# Altium project NEXUS32.PrjPcb (part 1 of 2)
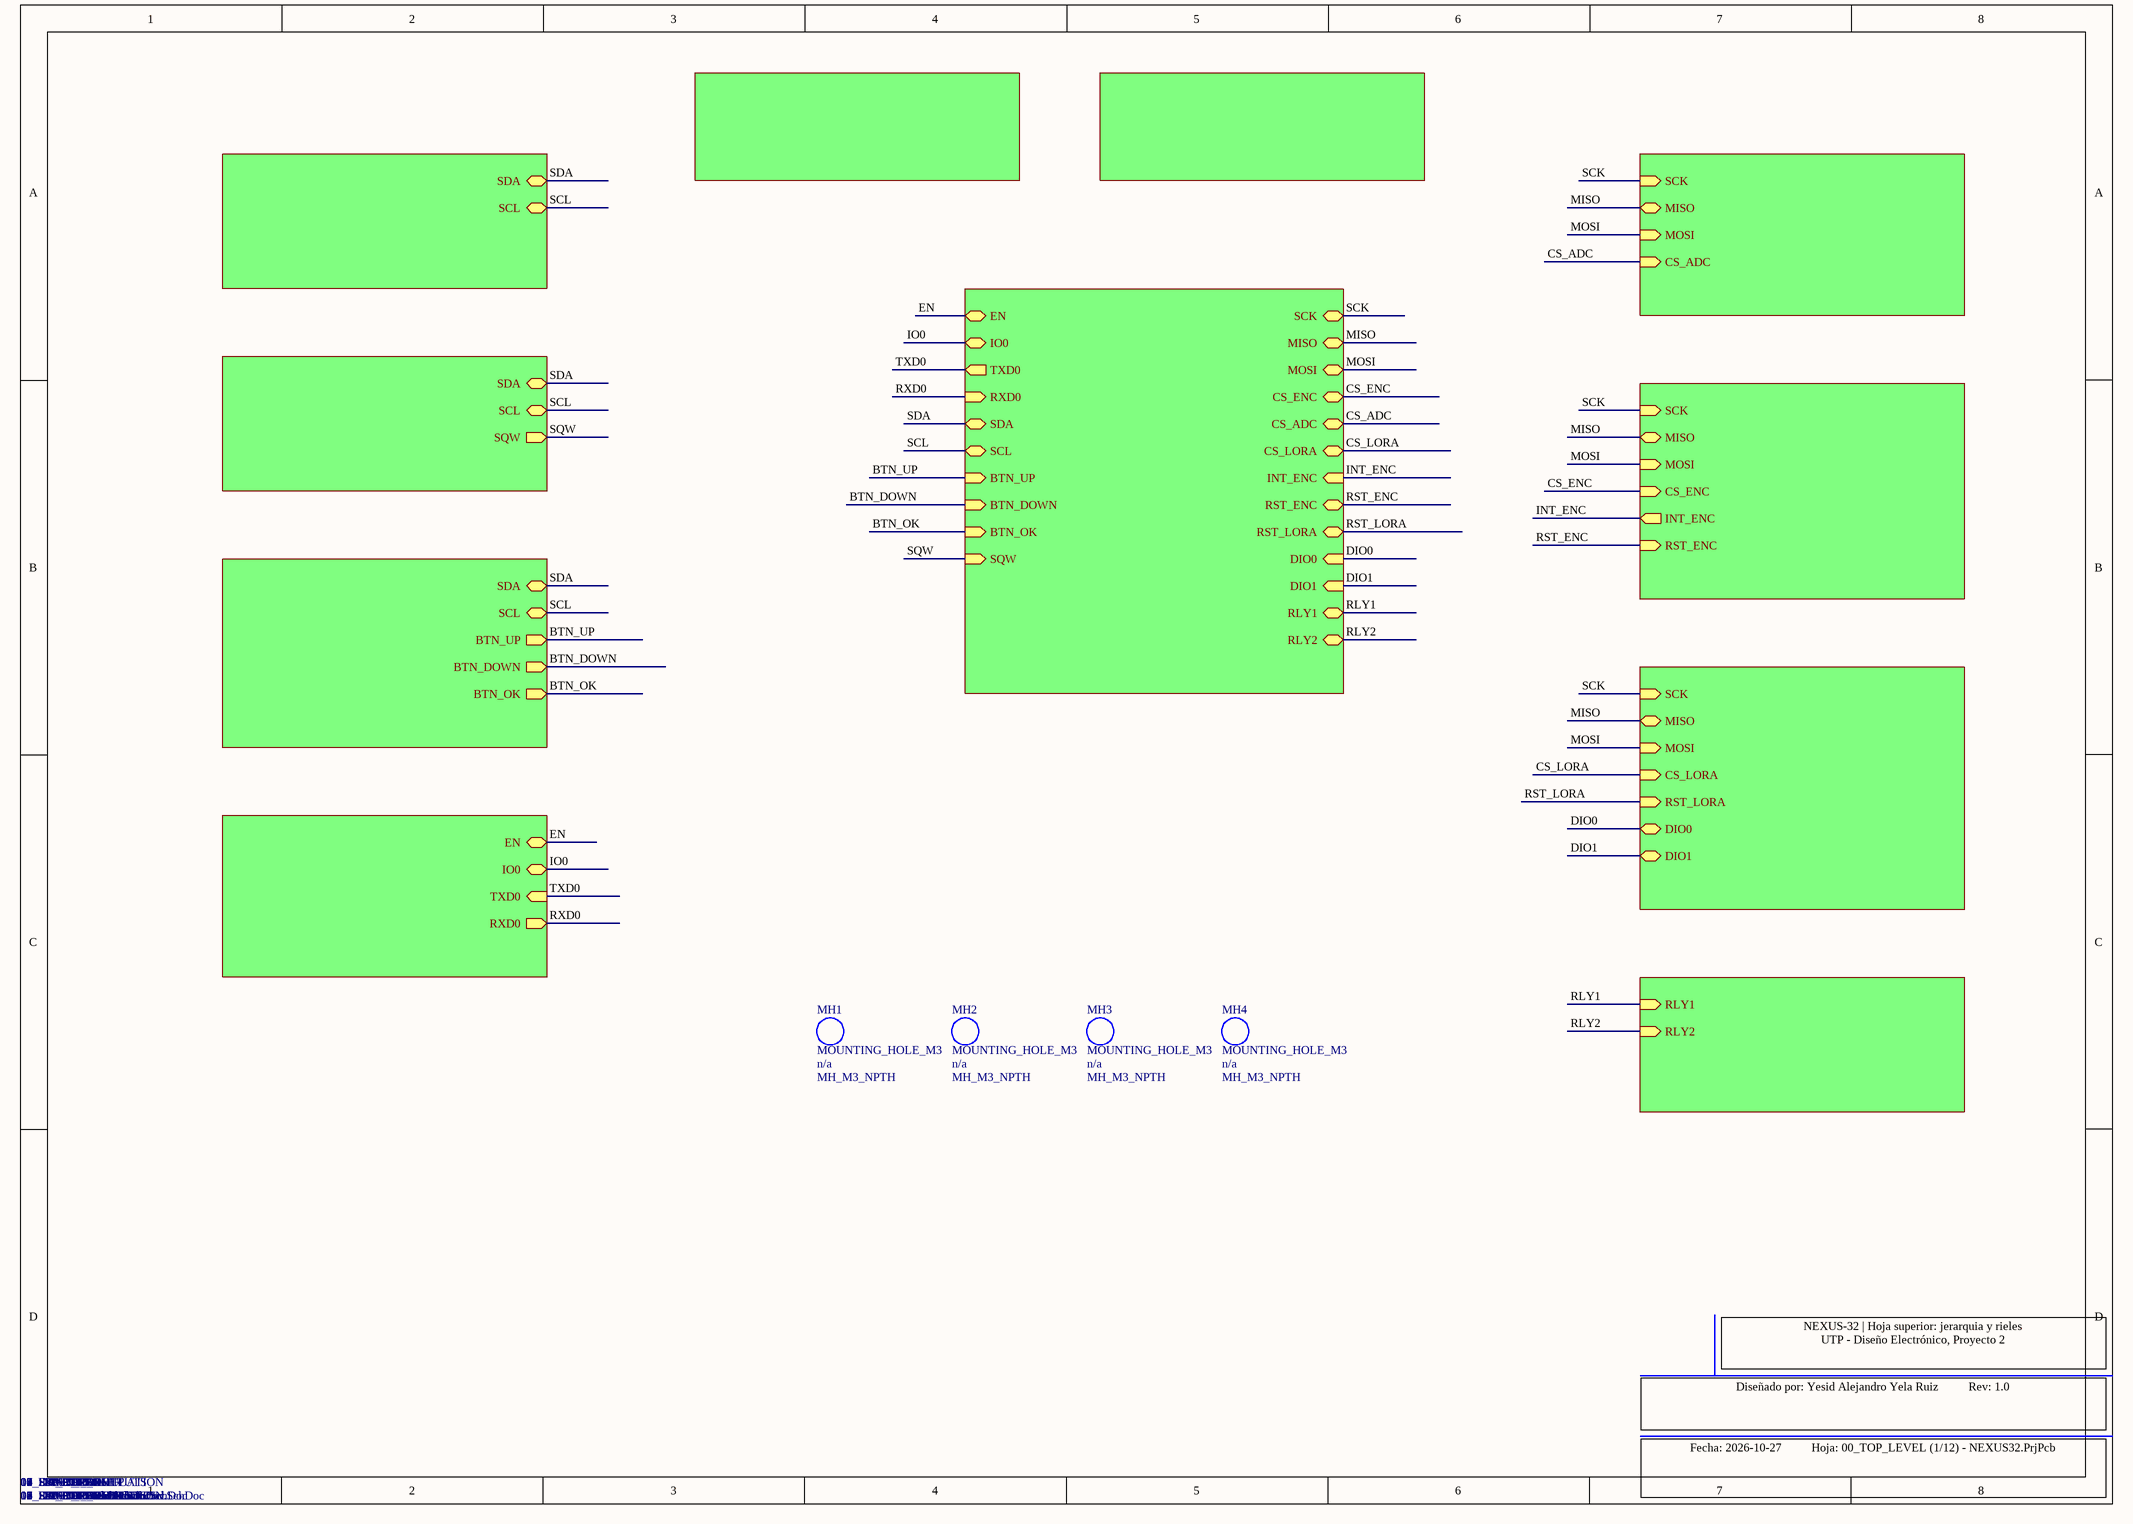
[diagram p0: 00_TOP_LEVEL.SchDoc]
12 sheets, 220 parts. Net scope: hierarchical (ports join the sheet entries above them; power ports are global).
Board file: NEXUS32.PcbDoc
Sheets:
  00_TOP_LEVEL.SchDoc
    03_ESP32_CORE = 03_ESP32_CORE.SchDoc
    04_I2C_EEPROM = 04_I2C_EEPROM.SchDoc
    05_I2C_RTC = 05_I2C_RTC.SchDoc
    06_I2C_OLED = 06_I2C_OLED.SchDoc
    10_UART_USB = 10_UART_USB.SchDoc
    07_SPI_ADC = 07_SPI_ADC.SchDoc
    08_SPI_ETHERNET = 08_SPI_ETHERNET.SchDoc
    09_SPI_LORA = 09_SPI_LORA.SchDoc
    11_DIGITAL_OUTPUTS = 11_DIGITAL_OUTPUTS.SchDoc
    01_INPUT_POWER = 01_INPUT_POWER.SchDoc
    02_POWER_REGULATION = 02_POWER_REGULATION.SchDoc

## Sheet 00_TOP_LEVEL.SchDoc
size A3

### Parts
MH1  MOUNTING_HOLE_M3  Manufacturer Part Number: MH_M3_NPTH  [MH_M3]
MH2  MOUNTING_HOLE_M3  Manufacturer Part Number: MH_M3_NPTH  [MH_M3]
MH3  MOUNTING_HOLE_M3  Manufacturer Part Number: MH_M3_NPTH  [MH_M3]
MH4  MOUNTING_HOLE_M3  Manufacturer Part Number: MH_M3_NPTH  [MH_M3]

### Sub-sheets
01_INPUT_POWER = 01_INPUT_POWER.SchDoc: no entries
02_POWER_REGULATION = 02_POWER_REGULATION.SchDoc: no entries
03_ESP32_CORE = 03_ESP32_CORE.SchDoc: EN (bidir), IO0 (bidir), TXD0 (out), RXD0 (in), SDA (bidir), SCL (bidir), BTN_UP (in), BTN_DOWN (in), BTN_OK (in), SQW (in), SCK (bidir), MISO (bidir), MOSI (bidir), CS_ENC (bidir), CS_ADC (bidir), CS_LORA (bidir), INT_ENC (in), RST_ENC (bidir), RST_LORA (bidir), DIO0 (in), DIO1 (in), RLY1 (bidir), RLY2 (bidir)
04_I2C_EEPROM = 04_I2C_EEPROM.SchDoc: SDA (bidir), SCL (bidir)
05_I2C_RTC = 05_I2C_RTC.SchDoc: SDA (bidir), SCL (bidir), SQW (out)
06_I2C_OLED = 06_I2C_OLED.SchDoc: SDA (bidir), SCL (bidir), BTN_UP (out), BTN_DOWN (out), BTN_OK (out)
07_SPI_ADC = 07_SPI_ADC.SchDoc: SCK (in), MISO (bidir), MOSI (in), CS_ADC (in)
08_SPI_ETHERNET = 08_SPI_ETHERNET.SchDoc: SCK (in), MISO (bidir), MOSI (in), CS_ENC (in), INT_ENC (out), RST_ENC (in)
09_SPI_LORA = 09_SPI_LORA.SchDoc: SCK (in), MISO (bidir), MOSI (in), CS_LORA (in), RST_LORA (in), DIO0 (bidir), DIO1 (bidir)
10_UART_USB = 10_UART_USB.SchDoc: EN (bidir), IO0 (bidir), TXD0 (in), RXD0 (out)
11_DIGITAL_OUTPUTS = 11_DIGITAL_OUTPUTS.SchDoc: RLY1 (in), RLY2 (in)

### Nets
BTN_DOWN: sheet 03_ESP32_CORE/BTN_DOWN, sheet 06_I2C_OLED/BTN_DOWN
BTN_OK: sheet 03_ESP32_CORE/BTN_OK, sheet 06_I2C_OLED/BTN_OK
BTN_UP: sheet 03_ESP32_CORE/BTN_UP, sheet 06_I2C_OLED/BTN_UP
CS_ADC: sheet 03_ESP32_CORE/CS_ADC, sheet 07_SPI_ADC/CS_ADC
CS_ENC: sheet 03_ESP32_CORE/CS_ENC, sheet 08_SPI_ETHERNET/CS_ENC
CS_LORA: sheet 03_ESP32_CORE/CS_LORA, sheet 09_SPI_LORA/CS_LORA
DIO0: sheet 03_ESP32_CORE/DIO0, sheet 09_SPI_LORA/DIO0
DIO1: sheet 03_ESP32_CORE/DIO1, sheet 09_SPI_LORA/DIO1
EN: sheet 03_ESP32_CORE/EN, sheet 10_UART_USB/EN
INT_ENC: sheet 03_ESP32_CORE/INT_ENC, sheet 08_SPI_ETHERNET/INT_ENC
IO0: sheet 03_ESP32_CORE/IO0, sheet 10_UART_USB/IO0
MISO: sheet 03_ESP32_CORE/MISO, sheet 07_SPI_ADC/MISO, sheet 08_SPI_ETHERNET/MISO, sheet 09_SPI_LORA/MISO
MOSI: sheet 03_ESP32_CORE/MOSI, sheet 07_SPI_ADC/MOSI, sheet 08_SPI_ETHERNET/MOSI, sheet 09_SPI_LORA/MOSI
RLY1: sheet 03_ESP32_CORE/RLY1, sheet 11_DIGITAL_OUTPUTS/RLY1
RLY2: sheet 03_ESP32_CORE/RLY2, sheet 11_DIGITAL_OUTPUTS/RLY2
RST_ENC: sheet 03_ESP32_CORE/RST_ENC, sheet 08_SPI_ETHERNET/RST_ENC
RST_LORA: sheet 03_ESP32_CORE/RST_LORA, sheet 09_SPI_LORA/RST_LORA
RXD0: sheet 03_ESP32_CORE/RXD0, sheet 10_UART_USB/RXD0
SCK: sheet 03_ESP32_CORE/SCK, sheet 07_SPI_ADC/SCK, sheet 08_SPI_ETHERNET/SCK, sheet 09_SPI_LORA/SCK
SCL: sheet 03_ESP32_CORE/SCL, sheet 04_I2C_EEPROM/SCL, sheet 05_I2C_RTC/SCL, sheet 06_I2C_OLED/SCL
SDA: sheet 03_ESP32_CORE/SDA, sheet 04_I2C_EEPROM/SDA, sheet 05_I2C_RTC/SDA, sheet 06_I2C_OLED/SDA
SQW: sheet 03_ESP32_CORE/SQW, sheet 05_I2C_RTC/SQW
TXD0: sheet 03_ESP32_CORE/TXD0, sheet 10_UART_USB/TXD0

### Notes on the sheet
- NEXUS-32 | Hoja superior: jerarquia y rieles
  UTP - Diseño Electrónico, Proyecto 2
- Diseñado por: Yesid Alejandro Yela Ruiz          Rev: 1.0
- Fecha: 2026-10-27          Hoja: 00_TOP_LEVEL (1/12) - NEXUS32.PrjPcb

### Library data of the parts
MH1-MH4 = MOUNTING_HOLE_M3: Agujero de montaje M3 NPTH (sin pines, sin red); Manufacturer: n/a

## Sheet 03_ESP32_CORE.SchDoc
size A3
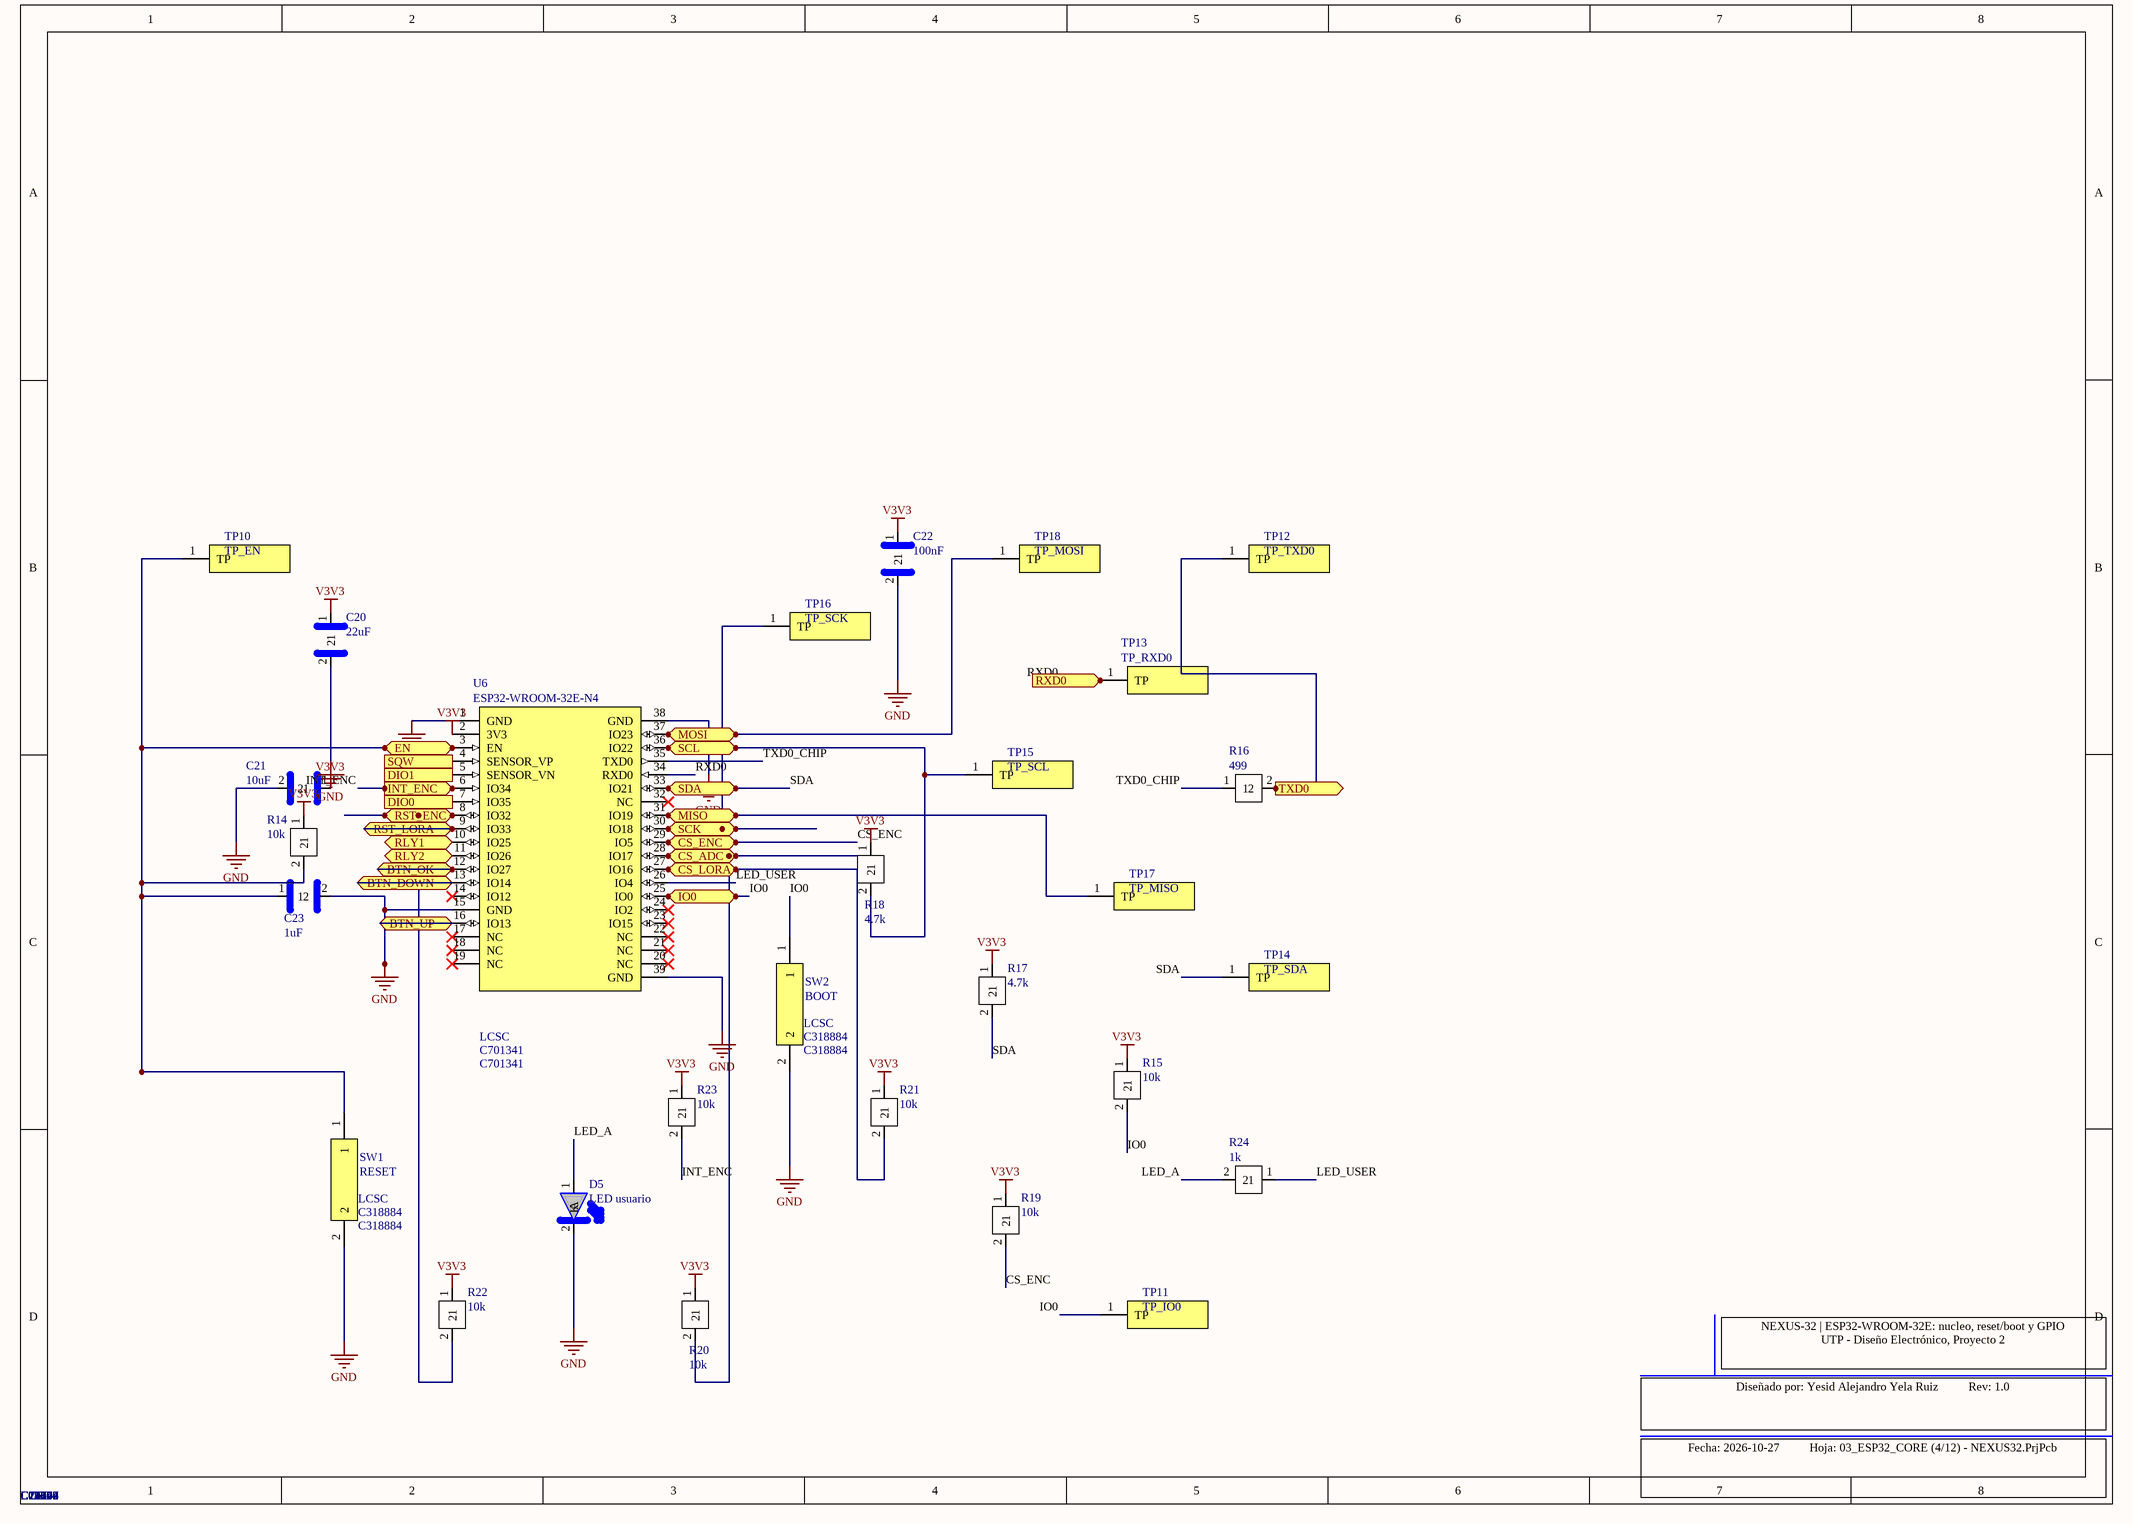
[diagram p1: 03_ESP32_CORE.SchDoc]

### Parts
C20  22uF  Supplier 1: LCSC  Supplier Part Number 1: C29277  [C_0805]
C21  10uF  Supplier 1: LCSC  Supplier Part Number 1: C19702  [R_0603]
C22  100nF  Supplier 1: LCSC  Supplier Part Number 1: C14663  [R_0603]
C23  1uF  Supplier 1: LCSC  Supplier Part Number 1: C15849  [R_0603]
D5  LED usuario  Supplier 1: LCSC  Supplier Part Number 1: C2286  [LED_0603]
R14  10k  Supplier 1: LCSC  Supplier Part Number 1: C25804  [R_0603]
R15  10k  Supplier 1: LCSC  Supplier Part Number 1: C25804  [R_0603]
R16  499  Supplier 1: LCSC  Supplier Part Number 1: C23065  [R_0603]
R17  4.7k  Supplier 1: LCSC  Supplier Part Number 1: C23162  [R_0603]
R18  4.7k  Supplier 1: LCSC  Supplier Part Number 1: C23162  [R_0603]
R19  10k  Supplier 1: LCSC  Supplier Part Number 1: C25804  [R_0603]
R20  10k  Supplier 1: LCSC  Supplier Part Number 1: C25804  [R_0603]
R21  10k  Supplier 1: LCSC  Supplier Part Number 1: C25804  [R_0603]
R22  10k  Supplier 1: LCSC  Supplier Part Number 1: C25804  [R_0603]
R23  10k  Supplier 1: LCSC  Supplier Part Number 1: C25804  [R_0603]
R24  1k  Supplier 1: LCSC  Supplier Part Number 1: C21190  [R_0603]
SW1  RESET  Supplier 1: LCSC  Supplier Part Number 1: C318884  [SW_TS-1187A]
SW2  BOOT  Supplier 1: LCSC  Supplier Part Number 1: C318884  [SW_TS-1187A]
TP10  TP_EN  [TP_PAD_1.5mm]
TP11  TP_IO0  [TP_PAD_1.5mm]
TP12  TP_TXD0  [TP_PAD_1.5mm]
TP13  TP_RXD0  [TP_PAD_1.5mm]
TP14  TP_SDA  [TP_PAD_1.5mm]
TP15  TP_SCL  [TP_PAD_1.5mm]
TP16  TP_SCK  [TP_PAD_1.5mm]
TP17  TP_MISO  [TP_PAD_1.5mm]
TP18  TP_MOSI  [TP_PAD_1.5mm]
U6  ESP32-WROOM-32E-N4  Supplier 1: LCSC  Supplier Part Number 1: C701341  [ESP32-WROOM-32E]

### Ports
BTN_DOWN (bidir), BTN_OK (bidir), BTN_UP (bidir), CS_ADC (bidir), CS_ENC (bidir), CS_LORA (bidir), DIO0 (in), DIO1 (in), EN (bidir), INT_ENC (in), IO0 (bidir), MISO (bidir), MOSI (bidir), RLY1 (bidir), RLY2 (bidir), RST_ENC (bidir), RST_LORA (bidir), RXD0 (in), SCK (bidir), SCL (bidir), SDA (bidir), SQW (in), TXD0 (out)

### Nets
GND: C20.2 C21.2 C22.2 C23.2 D5.2(K) SW1.2 SW2.2 U6.1(GND) U6.15(GND) U6.38(GND) U6.39(GND)
V3V3: C20.1 C21.1 C22.1 R14.1 R15.1 R17.1 R18.1 R19.1 R20.1 R21.1 R22.1 R23.1 U6.2(3V3)
BTN_DOWN: U6.13(IO14) ; port BTN_DOWN
BTN_OK: U6.12(IO27) ; port BTN_OK
BTN_UP: U6.16(IO13) ; port BTN_UP
CS_ADC: R20.2 U6.28(IO17) ; port CS_ADC
CS_ENC: R19.2 U6.29(IO5) ; port CS_ENC
CS_LORA: R21.2 U6.27(IO16) ; port CS_LORA
DIO0: U6.7(IO35) ; port DIO0
DIO1: U6.5(SENSOR_VN) ; port DIO1
EN: C23.1 R14.2 SW1.1 TP10.1(TP) U6.3(EN) ; port EN
INT_ENC: R23.2 U6.6(IO34) ; port INT_ENC
IO0: R15.2 SW2.1 TP11.1(TP) U6.25(IO0) ; port IO0
LED_A: D5.1(A) R24.2
LED_USER: R24.1 U6.26(IO4)
MISO: TP17.1(TP) U6.31(IO19) ; port MISO
MOSI: TP18.1(TP) U6.37(IO23) ; port MOSI
RLY1: U6.10(IO25) ; port RLY1
RLY2: U6.11(IO26) ; port RLY2
RST_ENC: R22.2 U6.8(IO32) ; port RST_ENC
RST_LORA: U6.9(IO33) ; port RST_LORA
RXD0: TP13.1(TP) U6.34(RXD0) ; port RXD0
SCK: TP16.1(TP) U6.30(IO18) ; port SCK
SCL: R18.2 TP15.1(TP) U6.36(IO22) ; port SCL
SDA: R17.2 TP14.1(TP) U6.33(IO21) ; port SDA
SQW: U6.4(SENSOR_VP) ; port SQW
TXD0: R16.2 TP12.1(TP) ; port TXD0
TXD0_CHIP: R16.1 U6.35(TXD0)

Not connected (* = marked no-connect by the designer): U6 14(IO12)* 17(NC)* 18(NC)* 19(NC)* 20(NC)* 21(NC)* 22(NC)* 23(IO15)* 24(IO2)* 32(NC)*

### Notes on the sheet
- NEXUS-32 | ESP32-WROOM-32E: nucleo, reset/boot y GPIO
  UTP - Diseño Electrónico, Proyecto 2
- Diseñado por: Yesid Alejandro Yela Ruiz          Rev: 1.0
- Fecha: 2026-10-27          Hoja: 03_ESP32_CORE (4/12) - NEXUS32.PrjPcb

### Library data of the parts
C20 = CAP_0805: Condensador ceramico SMD 0805; Manufacturer: Samsung; Manufacturer Part Number: CL21A226MPQNNNE; Datasheet: https://wmsc.lcsc.com/wmsc/upload/file/pdf/v2/lcsc/2206010045_UNI-ROYAL-Uniroyal-Elec-0603WAF1002T5E_C25804.pdf; LCSC Part #: C29277
C21 = CAP_0603: Condensador ceramico SMD 0603; Manufacturer: Samsung; Manufacturer Part Number: CL10A106KP8NNNC; Datasheet: https://wmsc.lcsc.com/wmsc/upload/file/pdf/v2/lcsc/2206010045_UNI-ROYAL-Uniroyal-Elec-0603WAF1002T5E_C25804.pdf; LCSC Part #: C19702
C22 = CAP_0603: Condensador ceramico SMD 0603; Manufacturer: YAGEO; Manufacturer Part Number: CC0603KRX7R9BB104; Datasheet: https://wmsc.lcsc.com/wmsc/upload/file/pdf/v2/lcsc/2206010045_UNI-ROYAL-Uniroyal-Elec-0603WAF1002T5E_C25804.pdf; LCSC Part #: C14663
C23 = CAP_0603: Condensador ceramico SMD 0603; Manufacturer: Samsung; Manufacturer Part Number: CL10A105KB8NNNC; Datasheet: https://wmsc.lcsc.com/wmsc/upload/file/pdf/v2/lcsc/2206010045_UNI-ROYAL-Uniroyal-Elec-0603WAF1002T5E_C25804.pdf; LCSC Part #: C15849
D5 = LED_0603: LED SMD 0603; Manufacturer: Hubei KENTO; Manufacturer Part Number: KT-0603R; Datasheet: https://wmsc.lcsc.com/wmsc/upload/file/pdf/v2/lcsc/2206010045_UNI-ROYAL-Uniroyal-Elec-0603WAF1002T5E_C25804.pdf; LCSC Part #: C2286
R14 R15 R19-R23 = RES_0603: Resistencia SMD 0603; Manufacturer: UNI-ROYAL; Manufacturer Part Number: 0603WAF1002T5E; Datasheet: https://wmsc.lcsc.com/wmsc/upload/file/pdf/v2/lcsc/2206010045_UNI-ROYAL-Uniroyal-Elec-0603WAF1002T5E_C25804.pdf; LCSC Part #: C25804
R16 = RES_0603: Resistencia SMD 0603; Manufacturer: UNI-ROYAL; Manufacturer Part Number: 0603WAF4990T5E; Datasheet: https://wmsc.lcsc.com/wmsc/upload/file/pdf/v2/lcsc/2206010045_UNI-ROYAL-Uniroyal-Elec-0603WAF1002T5E_C25804.pdf; LCSC Part #: C23065
R17 R18 = RES_0603: Resistencia SMD 0603; Manufacturer: UNI-ROYAL; Manufacturer Part Number: 0603WAF4701T5E; Datasheet: https://wmsc.lcsc.com/wmsc/upload/file/pdf/v2/lcsc/2206010045_UNI-ROYAL-Uniroyal-Elec-0603WAF1002T5E_C25804.pdf; LCSC Part #: C23162
R24 = RES_0603: Resistencia SMD 0603; Manufacturer: UNI-ROYAL; Manufacturer Part Number: 0603WAF1001T5E; Datasheet: https://wmsc.lcsc.com/wmsc/upload/file/pdf/v2/lcsc/2206010045_UNI-ROYAL-Uniroyal-Elec-0603WAF1002T5E_C25804.pdf; LCSC Part #: C21190
SW1 SW2 = TS-1187A-B-A-B: Pulsador tactil SMD 5.1x5.1 (XKB TS-1187A-B-A-B); pads A-B unidos (1) y C-D unidos (2); Manufacturer: XKB Connection; Manufacturer Part Number: TS-1187A-B-A-B; LCSC Part #: C318884; Datasheet: https://wmsc.lcsc.com/wmsc/upload/file/pdf/v2/lcsc/2304140030_XKB-Connection-TS-1187A-B-A-B_C318884.pdf
TP10-TP18 = TESTPOINT: Punto de prueba, pad desnudo de 1.5mm sin montaje; Manufacturer: n/a; Manufacturer Part Number: TP_PAD_1.5mm; Datasheet: https://wmsc.lcsc.com/wmsc/upload/file/pdf/v2/lcsc/2206010045_UNI-ROYAL-Uniroyal-Elec-0603WAF1002T5E_C25804.pdf
U6 = ESP32-WROOM-32E-N4: Modulo WiFi/BT ESP32-WROOM-32E-N4 (Espressif), 38 pines + pad GND; Manufacturer: Espressif Systems; Manufacturer Part Number: ESP32-WROOM-32E-N4; LCSC Part #: C701341; Datasheet: https://www.espressif.com/sites/default/files/documentation/esp32-wroom-32e_esp32-wroom-32ue_datasheet_en.pdf

## Sheet 04_I2C_EEPROM.SchDoc
size A4
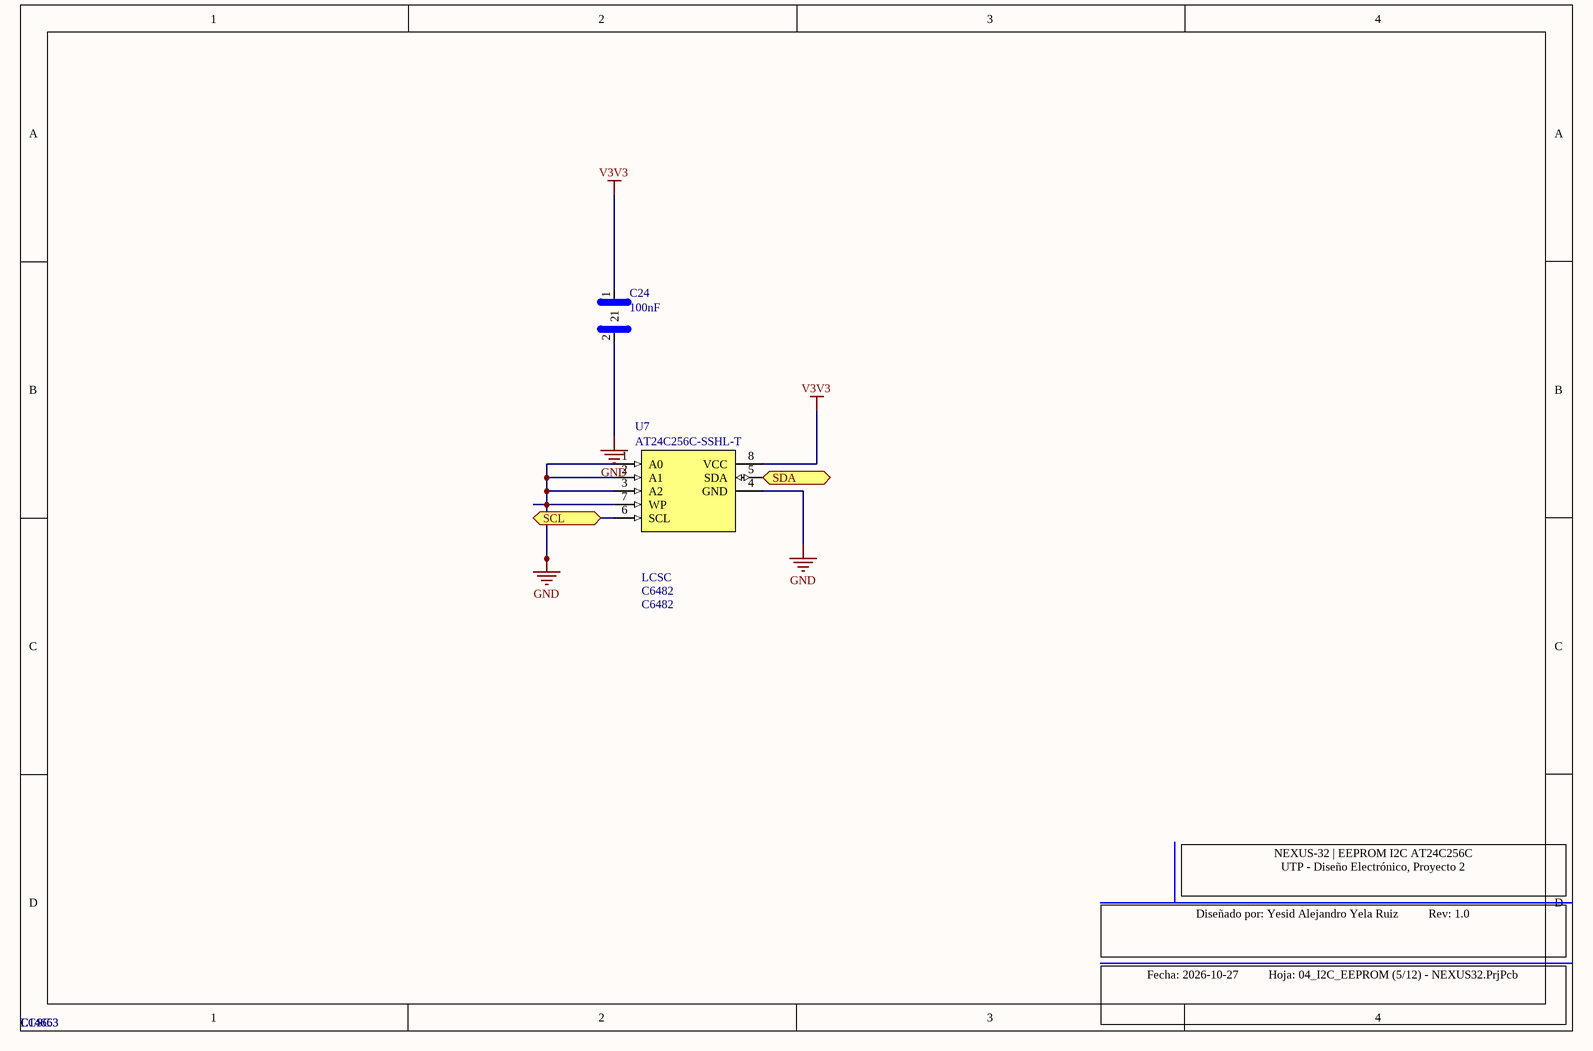
[diagram p2: 04_I2C_EEPROM.SchDoc]

### Parts
C24  100nF  Supplier 1: LCSC  Supplier Part Number 1: C14663  [R_0603]
U7  AT24C256C-SSHL-T  Supplier 1: LCSC  Supplier Part Number 1: C6482  [SOIC-8_3.9x4.9_P1.27]

### Ports
SCL (bidir), SDA (bidir)

### Nets
GND: C24.2 U7.1(A0) U7.2(A1) U7.3(A2) U7.4(GND) U7.7(WP)
V3V3: C24.1 U7.8(VCC)
SCL: U7.6(SCL) ; port SCL
SDA: U7.5(SDA) ; port SDA

### Notes on the sheet
- NEXUS-32 | EEPROM I2C AT24C256C
  UTP - Diseño Electrónico, Proyecto 2
- Diseñado por: Yesid Alejandro Yela Ruiz          Rev: 1.0
- Fecha: 2026-10-27          Hoja: 04_I2C_EEPROM (5/12) - NEXUS32.PrjPcb

### Library data of the parts
C24 = CAP_0603: as C22 on sheet 03_ESP32_CORE; Datasheet: https://wmsc.lcsc.com/wmsc/upload/file/pdf/v2/lcsc/2206010045_UNI-ROYAL-Uniroyal-Elec-0603WAF1002T5E_C25804.pdf; LCSC Part #: C14663
U7 = AT24C256C-SSHL-T: EEPROM I2C 256Kbit SOIC-8 (Microchip AT24C256C-SSHL-T); Manufacturer: Microchip Technology; Manufacturer Part Number: AT24C256C-SSHL-T; LCSC Part #: C6482; Datasheet: https://ww1.microchip.com/downloads/en/DeviceDoc/Atmel-8568-SEEPROM-AT24C256C-Datasheet.pdf

## Sheet 05_I2C_RTC.SchDoc
size A4
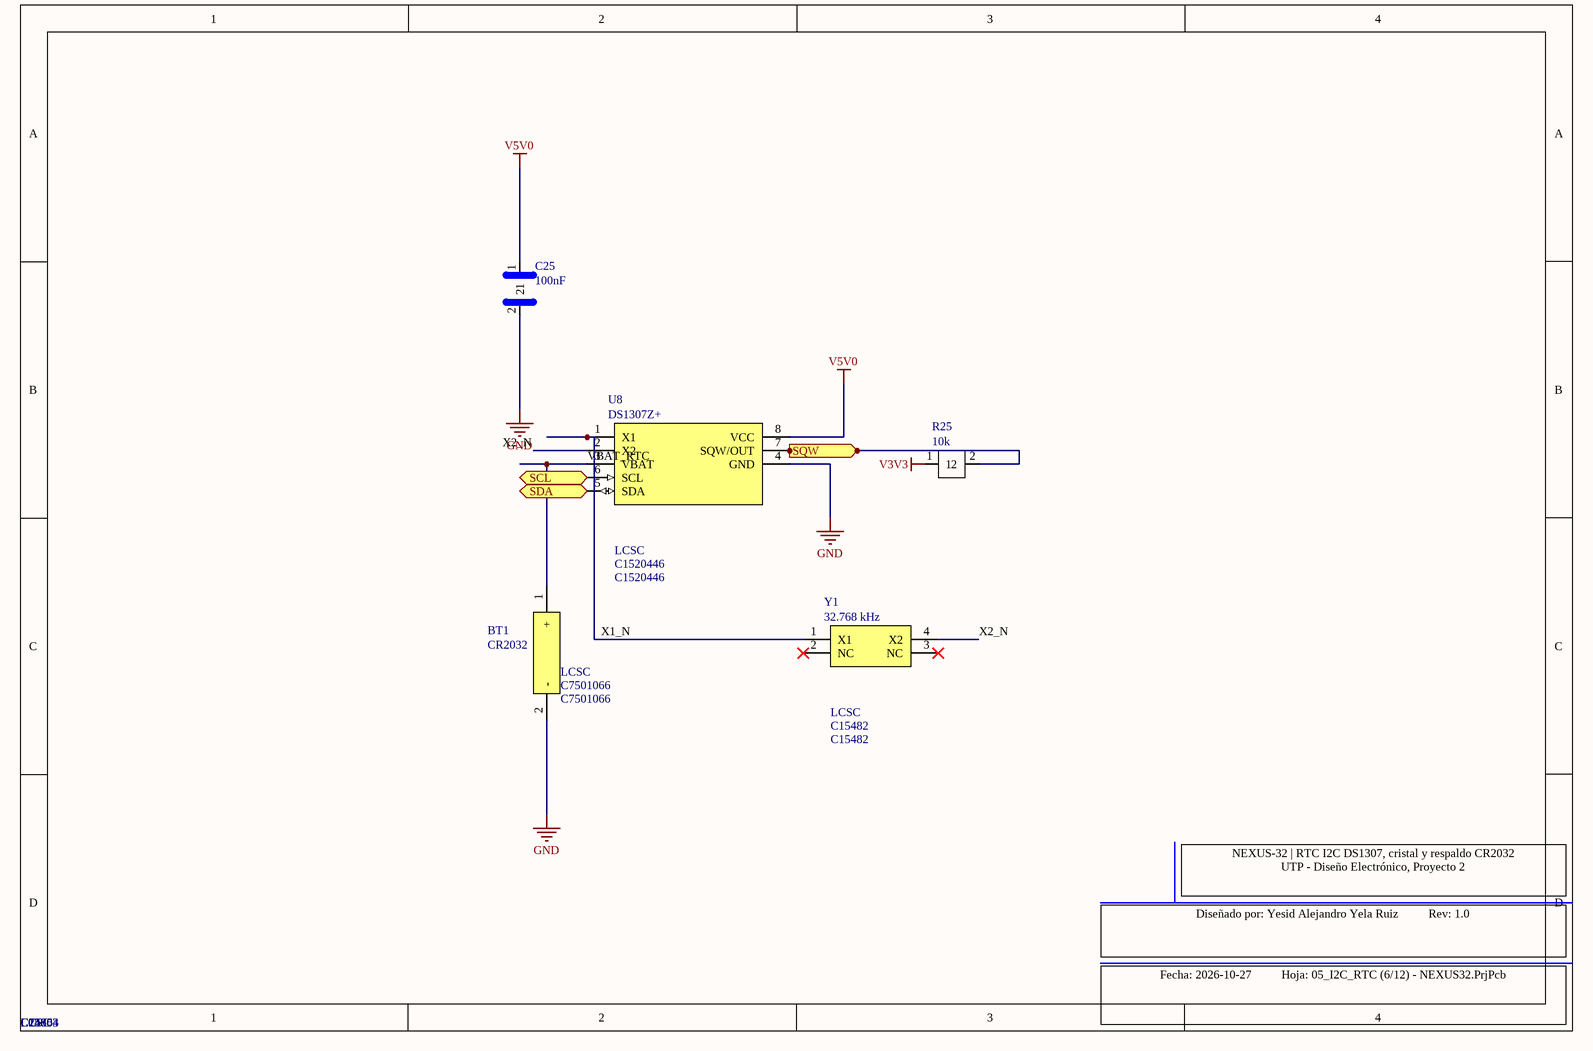
[diagram p3: 05_I2C_RTC.SchDoc]

### Parts
BT1  CR2032  Supplier 1: LCSC  Supplier Part Number 1: C7501066  [BAT-HLD-001]
C25  100nF  Supplier 1: LCSC  Supplier Part Number 1: C14663  [R_0603]
R25  10k  Supplier 1: LCSC  Supplier Part Number 1: C25804  [R_0603]
U8  DS1307Z+  Supplier 1: LCSC  Supplier Part Number 1: C1520446  [SOIC-8_3.9x4.9_P1.27]
Y1  32.768 kHz  Supplier 1: LCSC  Supplier Part Number 1: C15482  [XTAL_MC-146]

### Ports
SCL (bidir), SDA (bidir), SQW (out)

### Nets
GND: BT1.2(-) C25.2 U8.4(GND)
V3V3: R25.1
V5V0: C25.1 U8.8(VCC)
SCL: U8.6(SCL) ; port SCL
SDA: U8.5(SDA) ; port SDA
SQW: R25.2 U8.7(SQW/OUT) ; port SQW
VBAT_RTC: BT1.1(+) U8.3(VBAT)
X1_N: U8.1(X1) Y1.1(X1)
X2_N: U8.2(X2) Y1.4(X2)

Not connected (* = marked no-connect by the designer): Y1 2(NC)* 3(NC)*

### Notes on the sheet
- NEXUS-32 | RTC I2C DS1307, cristal y respaldo CR2032
  UTP - Diseño Electrónico, Proyecto 2
- Diseñado por: Yesid Alejandro Yela Ruiz          Rev: 1.0
- Fecha: 2026-10-27          Hoja: 05_I2C_RTC (6/12) - NEXUS32.PrjPcb

### Library data of the parts
BT1 = BAT-HLD-001: Portapilas CR2032 SMD (TE BAT-HLD-001); pad 1 = (+) dos pestanas laterales, pad 2 = (-) pad central; Manufacturer: TE Connectivity; Manufacturer Part Number: BAT-HLD-001; LCSC Part #: C7501066; Datasheet: https://wmsc.lcsc.com/wmsc/upload/file/pdf/v2/lcsc/2411212321_TE-Connectivity-BAT-HLD-001_C7501066.pdf
C25 = CAP_0603: as C22 on sheet 03_ESP32_CORE; Datasheet: https://wmsc.lcsc.com/wmsc/upload/file/pdf/v2/lcsc/2206010045_UNI-ROYAL-Uniroyal-Elec-0603WAF1002T5E_C25804.pdf; LCSC Part #: C14663
R25 = RES_0603: as R14 on sheet 03_ESP32_CORE; Datasheet: https://wmsc.lcsc.com/wmsc/upload/file/pdf/v2/lcsc/2206010045_UNI-ROYAL-Uniroyal-Elec-0603WAF1002T5E_C25804.pdf; LCSC Part #: C25804
U8 = DS1307Z+: RTC I2C 64x8 SOIC-8 150mil (Analog Devices/Maxim DS1307Z+); Manufacturer: Analog Devices (Maxim Integrated); Manufacturer Part Number: DS1307Z+; LCSC Part #: C1520446; Datasheet: https://www.farnell.com/datasheets/29949.pdf
Y1 = XTAL_MC146: Cristal 32.768kHz 12.5pF MC-146 (Epson Q13MC14620002); terminales #1 y #4, #2/#3 sin conexion; Manufacturer: Epson; Manufacturer Part Number: Q13MC14620002; LCSC Part #: C15482; Datasheet: https://wmsc.lcsc.com/wmsc/upload/file/pdf/v2/lcsc/2404180924_Seiko-Epson-Q13MC14620002_C15482.pdf

## Sheet 06_I2C_OLED.SchDoc
size A4
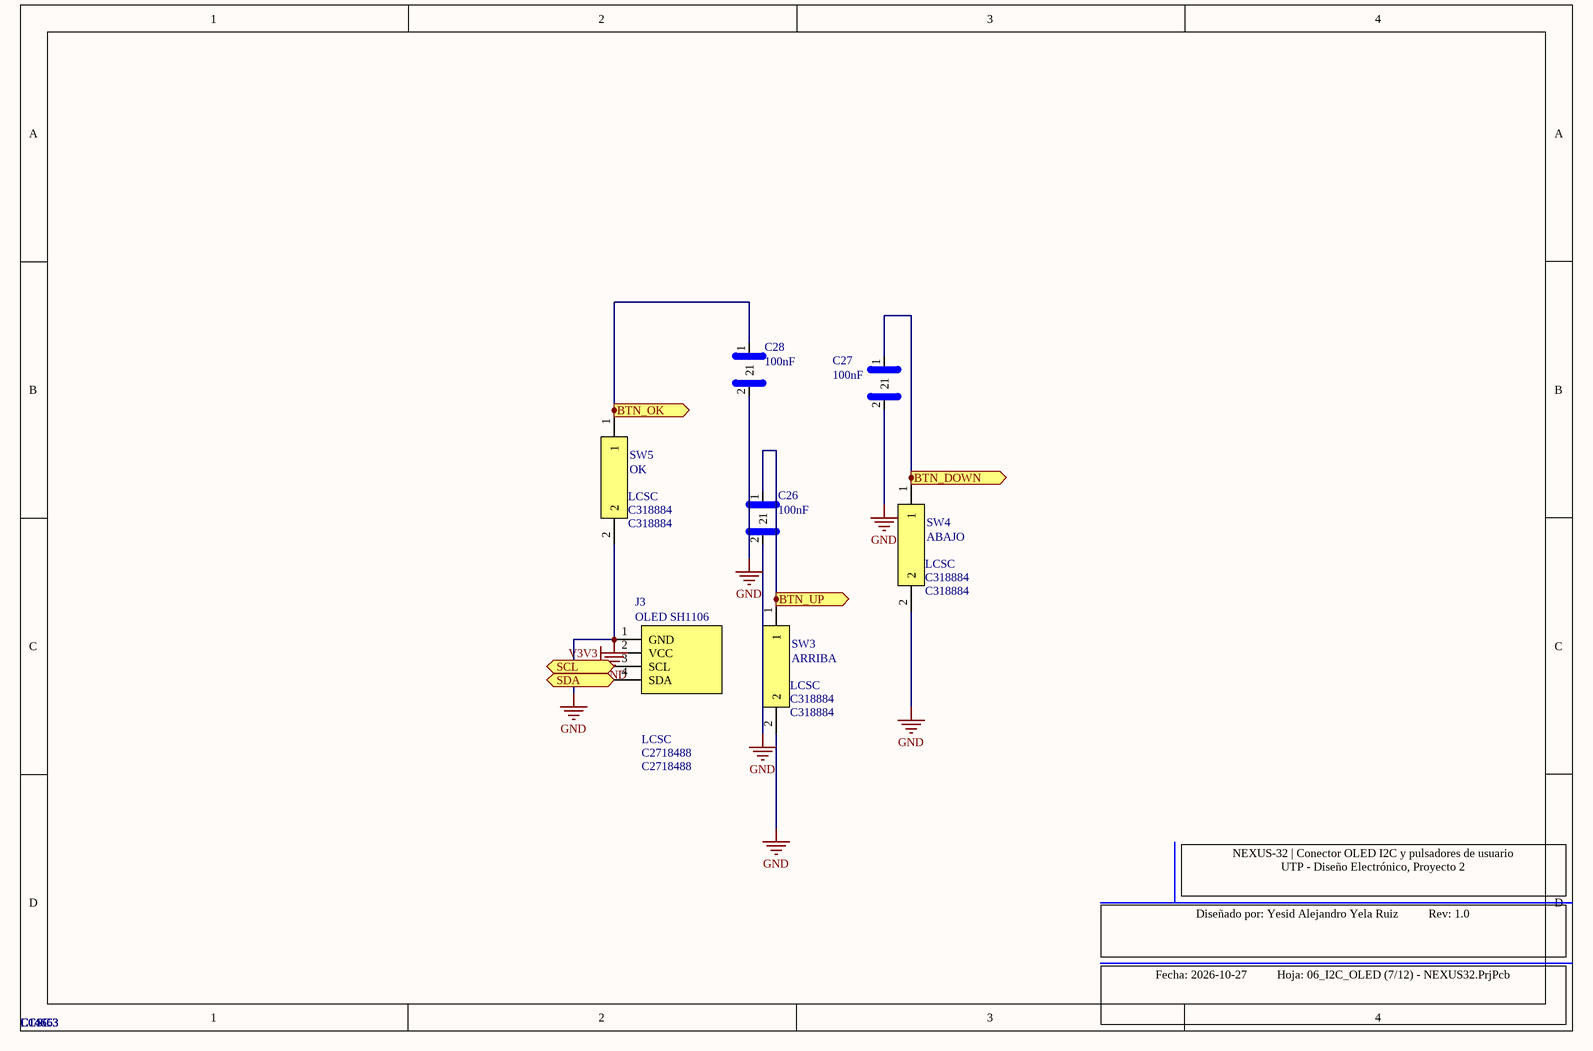
[diagram p4: 06_I2C_OLED.SchDoc]

### Parts
C26  100nF  Supplier 1: LCSC  Supplier Part Number 1: C14663  [R_0603]
C27  100nF  Supplier 1: LCSC  Supplier Part Number 1: C14663  [R_0603]
C28  100nF  Supplier 1: LCSC  Supplier Part Number 1: C14663  [R_0603]
J3  OLED SH1106  Supplier 1: LCSC  Supplier Part Number 1: C2718488  [HDR_1x4_P2.54_F]
SW3  ARRIBA  Supplier 1: LCSC  Supplier Part Number 1: C318884  [SW_TS-1187A]
SW4  ABAJO  Supplier 1: LCSC  Supplier Part Number 1: C318884  [SW_TS-1187A]
SW5  OK  Supplier 1: LCSC  Supplier Part Number 1: C318884  [SW_TS-1187A]

### Ports
BTN_DOWN (out), BTN_OK (out), BTN_UP (out), SCL (bidir), SDA (bidir)

### Nets
GND: C26.2 C27.2 C28.2 J3.1(GND) SW3.2 SW4.2 SW5.2
V3V3: J3.2(VCC)
BTN_DOWN: C27.1 SW4.1 ; port BTN_DOWN
BTN_OK: C28.1 SW5.1 ; port BTN_OK
BTN_UP: C26.1 SW3.1 ; port BTN_UP
SCL: J3.3(SCL) ; port SCL
SDA: J3.4(SDA) ; port SDA

### Notes on the sheet
- NEXUS-32 | Conector OLED I2C y pulsadores de usuario
  UTP - Diseño Electrónico, Proyecto 2
- Diseñado por: Yesid Alejandro Yela Ruiz          Rev: 1.0
- Fecha: 2026-10-27          Hoja: 06_I2C_OLED (7/12) - NEXUS32.PrjPcb

### Library data of the parts
C26-C28 = CAP_0603: as C22 on sheet 03_ESP32_CORE; Datasheet: https://wmsc.lcsc.com/wmsc/upload/file/pdf/v2/lcsc/2206010045_UNI-ROYAL-Uniroyal-Elec-0603WAF1002T5E_C25804.pdf; LCSC Part #: C14663
J3 = HDR_1x4_2.54_F: Cabezal hembra 1x4 paso 2.54mm para modulo OLED I2C (Boomele 2.54-1*4PFemale); orden GND-VCC-SCL-SDA (a confirmar con el modulo real); Manufacturer: Boomele; Manufacturer Part Number: 2.54-1*4PFemale; LCSC Part #: C2718488; Datasheet: https://wmsc.lcsc.com/wmsc/upload/file/pdf/v2/lcsc/2412111658_BOOMELE-Boom-Precision-Elec-2-54-1-4P_C2718488.pdf
SW3-SW5 = TS-1187A-B-A-B: as SW1 on sheet 03_ESP32_CORE; Manufacturer Part Number: TS-1187A-B-A-B; LCSC Part #: C318884; Datasheet: https://wmsc.lcsc.com/wmsc/upload/file/pdf/v2/lcsc/2304140030_XKB-Connection-TS-1187A-B-A-B_C318884.pdf

## Sheet 10_UART_USB.SchDoc
size A3
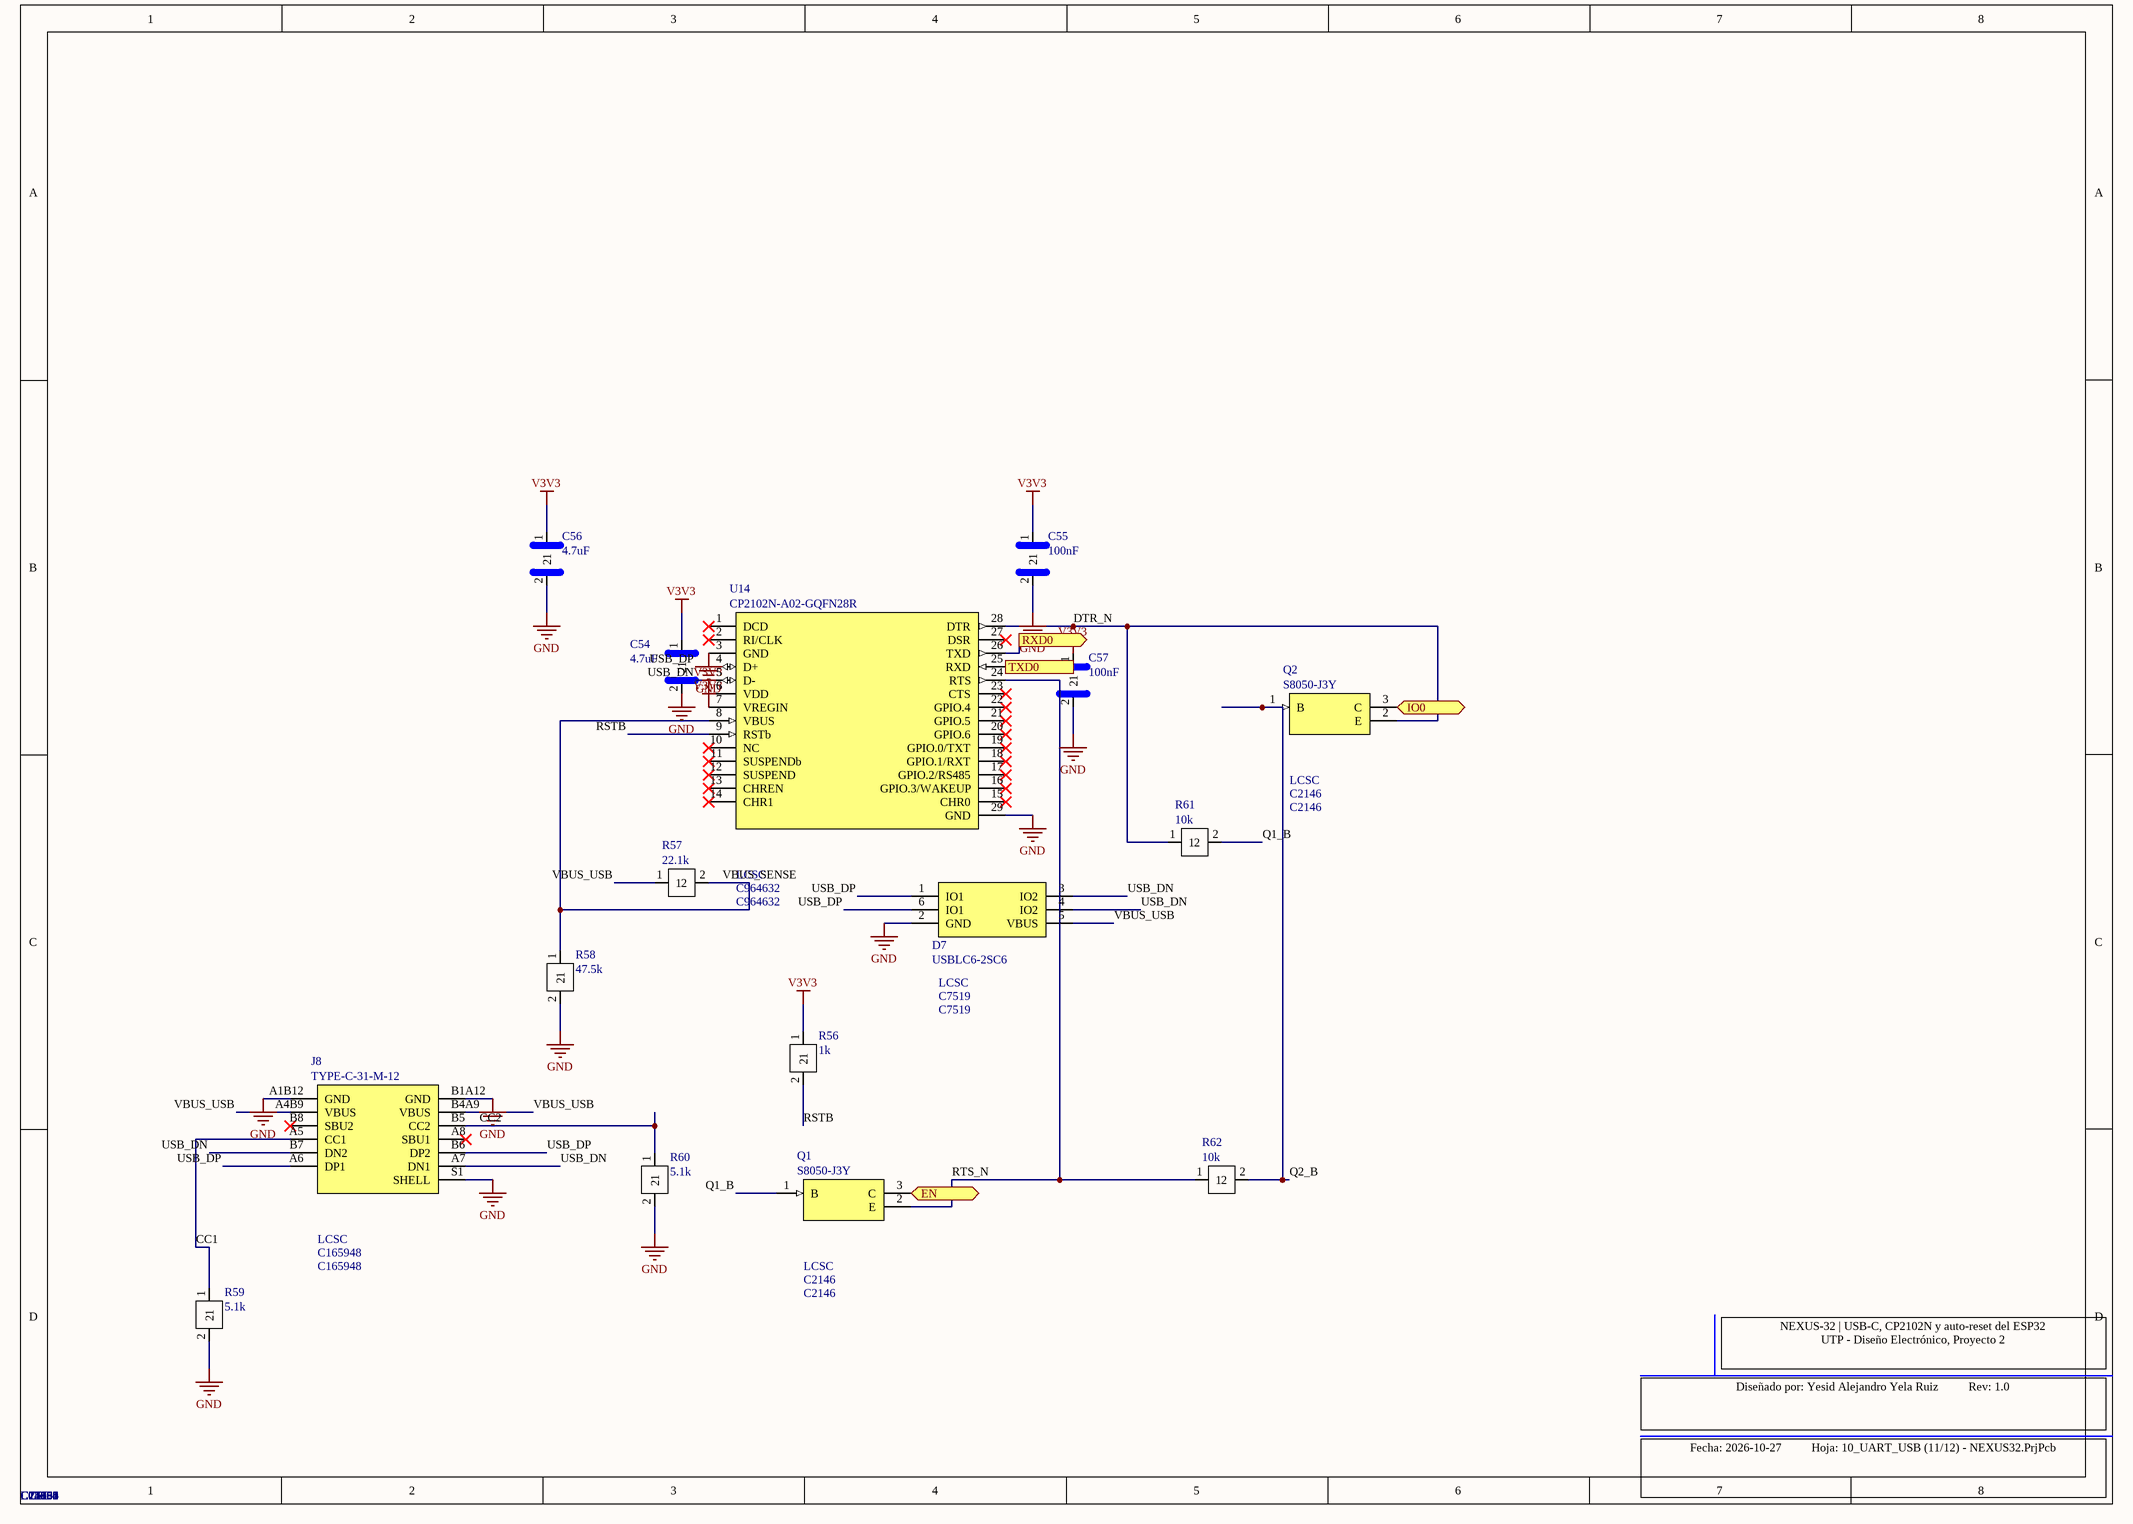
[diagram p5: 10_UART_USB.SchDoc]

### Parts
C54  4.7uF  Supplier 1: LCSC  Supplier Part Number 1: C1705  [R_0603]
C55  100nF  Supplier 1: LCSC  Supplier Part Number 1: C14663  [R_0603]
C56  4.7uF  Supplier 1: LCSC  Supplier Part Number 1: C1705  [R_0603]
C57  100nF  Supplier 1: LCSC  Supplier Part Number 1: C14663  [R_0603]
D7  USBLC6-2SC6  Supplier 1: LCSC  Supplier Part Number 1: C7519  [SOT-23-6_USBLC6]
J8  TYPE-C-31-M-12  Supplier 1: LCSC  Supplier Part Number 1: C165948  [USB-C_TYPE-C-31-M-12]
Q1  S8050-J3Y  Supplier 1: LCSC  Supplier Part Number 1: C2146  [SOT-23-3_DBZ]
Q2  S8050-J3Y  Supplier 1: LCSC  Supplier Part Number 1: C2146  [SOT-23-3_DBZ]
R56  1k  Supplier 1: LCSC  Supplier Part Number 1: C21190  [R_0603]
R57  22.1k  Supplier 1: LCSC  Supplier Part Number 1: C25961  [R_0603]
R58  47.5k  Supplier 1: LCSC  Supplier Part Number 1: C23061  [R_0603]
R59  5.1k  Supplier 1: LCSC  Supplier Part Number 1: C23186  [R_0603]
R60  5.1k  Supplier 1: LCSC  Supplier Part Number 1: C23186  [R_0603]
R61  10k  Supplier 1: LCSC  Supplier Part Number 1: C25804  [R_0603]
R62  10k  Supplier 1: LCSC  Supplier Part Number 1: C25804  [R_0603]
U14  CP2102N-A02-GQFN28R  Supplier 1: LCSC  Supplier Part Number 1: C964632  [QFN-28-EP_5x5_P0.5]

### Ports
EN (bidir), IO0 (bidir), RXD0 (out), TXD0 (in)

### Nets
GND: C54.2 C55.2 C56.2 C57.2 D7.2(GND) J8.A1B12(GND) J8.B1A12(GND) J8.S1(SHELL) R58.2 R59.2 R60.2 U14.3(GND) U14.29(GND)
V3V3: C54.1 C55.1 C56.1 C57.1 R56.1 U14.6(VDD) U14.7(VREGIN)
CC1: J8.A5(CC1) R59.1
CC2: J8.B5(CC2) R60.1
DTR_N: Q2.2(E) R61.1 U14.28(DTR)
EN: Q1.3(C) ; port EN
IO0: Q2.3(C) ; port IO0
Q1_B: Q1.1(B) R61.2
Q2_B: Q2.1(B) R62.2
RSTB: R56.2 U14.9(RSTb)
RTS_N: Q1.2(E) R62.1 U14.24(RTS)
RXD0: U14.26(TXD) ; port RXD0
TXD0: U14.25(RXD) ; port TXD0
USB_DN: D7.3(IO2) D7.4(IO2) J8.A7(DN1) J8.B7(DN2) U14.5(D-)
USB_DP: D7.1(IO1) D7.6(IO1) J8.A6(DP1) J8.B6(DP2) U14.4(D+)
VBUS_SENSE: R57.2 R58.1 U14.8(VBUS)
VBUS_USB: D7.5(VBUS) J8.A4B9(VBUS) J8.B4A9(VBUS) R57.1

Not connected (* = marked no-connect by the designer): J8 A8(SBU1)* B8(SBU2)*; U14 1(DCD)* 2(RI/CLK)* 10(NC)* 11(SUSPENDb)* 12(SUSPEND)* 13(CHREN)* 14(CHR1)* 15(CHR0)* 16(GPIO.3/WAKEUP)* 17(GPIO.2/RS485)* 18(GPIO.1/RXT)* 19(GPIO.0/TXT)* 20(GPIO.6)* 21(GPIO.5)* 22(GPIO.4)* 23(CTS)* 27(DSR)*

### Notes on the sheet
- NEXUS-32 | USB-C, CP2102N y auto-reset del ESP32
  UTP - Diseño Electrónico, Proyecto 2
- Diseñado por: Yesid Alejandro Yela Ruiz          Rev: 1.0
- Fecha: 2026-10-27          Hoja: 10_UART_USB (11/12) - NEXUS32.PrjPcb

### Library data of the parts
C54 C56 = CAP_0603: Condensador ceramico SMD 0603; Manufacturer: Samsung; Manufacturer Part Number: CL10A475KP8NNNC; Datasheet: https://wmsc.lcsc.com/wmsc/upload/file/pdf/v2/lcsc/2206010045_UNI-ROYAL-Uniroyal-Elec-0603WAF1002T5E_C25804.pdf; LCSC Part #: C1705
C55 C57 = CAP_0603: as C22 on sheet 03_ESP32_CORE; Datasheet: https://wmsc.lcsc.com/wmsc/upload/file/pdf/v2/lcsc/2206010045_UNI-ROYAL-Uniroyal-Elec-0603WAF1002T5E_C25804.pdf; LCSC Part #: C14663
D7 = USBLC6-2SC6: Proteccion ESD USB 2 lineas + VBUS SOT-23-6 (ST USBLC6-2SC6); Manufacturer: STMicroelectronics; Manufacturer Part Number: USBLC6-2SC6; LCSC Part #: C7519; Datasheet: https://wmsc.lcsc.com/wmsc/upload/file/pdf/v2/lcsc/2410121836_STMicroelectronics-USBLC6-2SC6_C7519.pdf
J8 = TYPE-C-31-M-12: Receptaculo USB Type-C 16 pines SMD (HRO TYPE-C-31-M-12); pads fusionados A1/B12, A4/B9, B4/A9, B1/A12; Manufacturer: Korean Hroparts Elec (HRO); Manufacturer Part Number: TYPE-C-31-M-12; LCSC Part #: C165948; Datasheet: https://wmsc.lcsc.com/wmsc/upload/file/pdf/v2/lcsc/2205251630_Korean-Hroparts-Elec-TYPE-C-31-M-12_C165948.pdf
Q1 Q2 = S8050-J3Y: Transistor NPN 25V 500mA SOT-23 (Changjing S8050 J3Y); Manufacturer: Jiangsu Changjing Electronics Technology (CJ); Manufacturer Part Number: S8050; LCSC Part #: C2146; Datasheet: https://wmsc.lcsc.com/wmsc/upload/file/pdf/v2/lcsc/2310131500_Jiangsu-Changjing-Electronics-Technology-Co---Ltd--S8050-J3Y-RANGE-200-350_C2146.pdf
R56 = RES_0603: as R24 on sheet 03_ESP32_CORE; Datasheet: https://wmsc.lcsc.com/wmsc/upload/file/pdf/v2/lcsc/2206010045_UNI-ROYAL-Uniroyal-Elec-0603WAF1002T5E_C25804.pdf; LCSC Part #: C21190
R57 = RES_0603: Resistencia SMD 0603; Manufacturer: UNI-ROYAL; Manufacturer Part Number: 0603WAF2212T5E; Datasheet: https://wmsc.lcsc.com/wmsc/upload/file/pdf/v2/lcsc/2206010045_UNI-ROYAL-Uniroyal-Elec-0603WAF1002T5E_C25804.pdf; LCSC Part #: C25961
R58 = RES_0603: Resistencia SMD 0603; Manufacturer: UNI-ROYAL; Manufacturer Part Number: 0603WAF4752T5E; Datasheet: https://wmsc.lcsc.com/wmsc/upload/file/pdf/v2/lcsc/2206010045_UNI-ROYAL-Uniroyal-Elec-0603WAF1002T5E_C25804.pdf; LCSC Part #: C23061
R59 R60 = RES_0603: Resistencia SMD 0603; Manufacturer: UNI-ROYAL; Manufacturer Part Number: 0603WAF5101T5E; Datasheet: https://wmsc.lcsc.com/wmsc/upload/file/pdf/v2/lcsc/2206010045_UNI-ROYAL-Uniroyal-Elec-0603WAF1002T5E_C25804.pdf; LCSC Part #: C23186
R61 R62 = RES_0603: as R14 on sheet 03_ESP32_CORE; Datasheet: https://wmsc.lcsc.com/wmsc/upload/file/pdf/v2/lcsc/2206010045_UNI-ROYAL-Uniroyal-Elec-0603WAF1002T5E_C25804.pdf; LCSC Part #: C25804
U14 = CP2102N-A02-GQFN28R: Puente USB a UART QFN-28 5x5 (Silicon Labs CP2102N-A02-GQFN28R); Manufacturer: Silicon Labs; Manufacturer Part Number: CP2102N-A02-GQFN28R; LCSC Part #: C964632; Datasheet: https://wmsc.lcsc.com/wmsc/upload/file/pdf/v2/lcsc/2304140030_SKYWORKS-SILICON-LABS-CP2102N-A02-GQFN28R_C964632.pdf

## Sheet 07_SPI_ADC.SchDoc
size A3
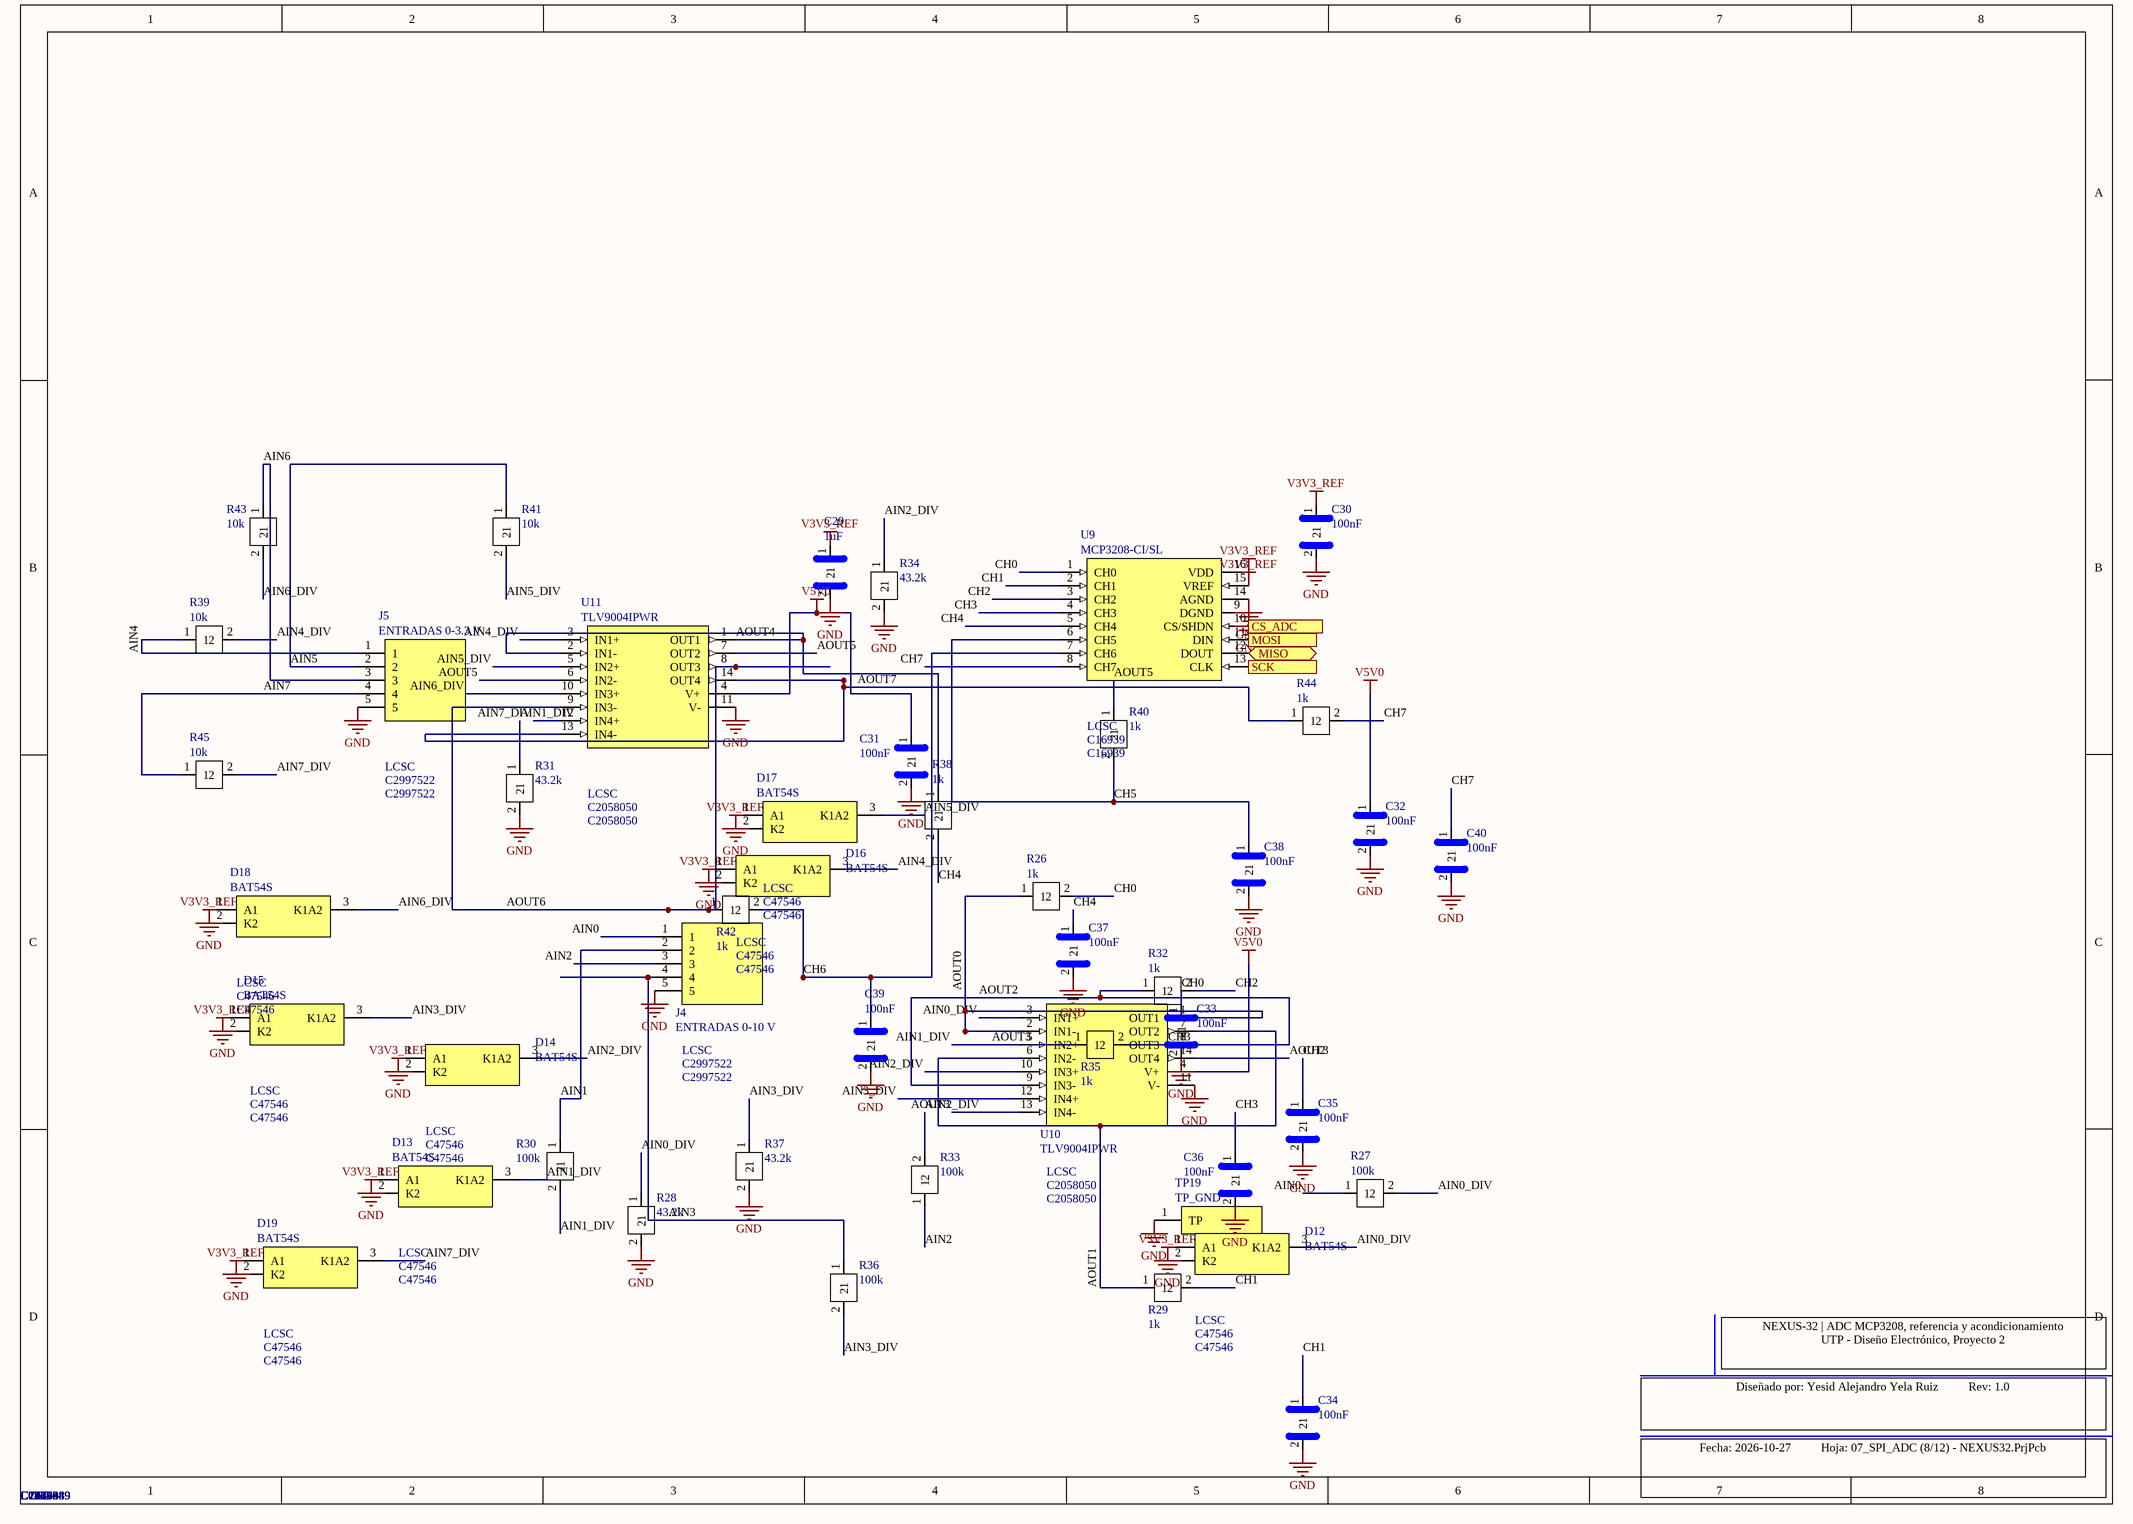
[diagram p6: 07_SPI_ADC.SchDoc]

### Parts
C29  1uF  Supplier 1: LCSC  Supplier Part Number 1: C15849  [R_0603]
C30  100nF  Supplier 1: LCSC  Supplier Part Number 1: C14663  [R_0603]
C31  100nF  Supplier 1: LCSC  Supplier Part Number 1: C14663  [R_0603]
C32  100nF  Supplier 1: LCSC  Supplier Part Number 1: C14663  [R_0603]
C33  100nF  Supplier 1: LCSC  Supplier Part Number 1: C14663  [R_0603]
C34  100nF  Supplier 1: LCSC  Supplier Part Number 1: C14663  [R_0603]
C35  100nF  Supplier 1: LCSC  Supplier Part Number 1: C14663  [R_0603]
C36  100nF  Supplier 1: LCSC  Supplier Part Number 1: C14663  [R_0603]
C37  100nF  Supplier 1: LCSC  Supplier Part Number 1: C14663  [R_0603]
C38  100nF  Supplier 1: LCSC  Supplier Part Number 1: C14663  [R_0603]
C39  100nF  Supplier 1: LCSC  Supplier Part Number 1: C14663  [R_0603]
C40  100nF  Supplier 1: LCSC  Supplier Part Number 1: C14663  [R_0603]
D12  BAT54S  Supplier 1: LCSC  Supplier Part Number 1: C47546  [SOT-23-3_DBZ]
D13  BAT54S  Supplier 1: LCSC  Supplier Part Number 1: C47546  [SOT-23-3_DBZ]
D14  BAT54S  Supplier 1: LCSC  Supplier Part Number 1: C47546  [SOT-23-3_DBZ]
D15  BAT54S  Supplier 1: LCSC  Supplier Part Number 1: C47546  [SOT-23-3_DBZ]
D16  BAT54S  Supplier 1: LCSC  Supplier Part Number 1: C47546  [SOT-23-3_DBZ]
D17  BAT54S  Supplier 1: LCSC  Supplier Part Number 1: C47546  [SOT-23-3_DBZ]
D18  BAT54S  Supplier 1: LCSC  Supplier Part Number 1: C47546  [SOT-23-3_DBZ]
D19  BAT54S  Supplier 1: LCSC  Supplier Part Number 1: C47546  [SOT-23-3_DBZ]
J4  ENTRADAS 0-10 V  Supplier 1: LCSC  Supplier Part Number 1: C2997522  [TB_DB127S-5.08-5P]
J5  ENTRADAS 0-3.3 V  Supplier 1: LCSC  Supplier Part Number 1: C2997522  [TB_DB127S-5.08-5P]
R26  1k  Supplier 1: LCSC  Supplier Part Number 1: C21190  [R_0603]
R27  100k  Supplier 1: LCSC  Supplier Part Number 1: C122538  [R_0603]
R28  43.2k  Supplier 1: LCSC  Supplier Part Number 1: C2989349  [R_0603]
R29  1k  Supplier 1: LCSC  Supplier Part Number 1: C21190  [R_0603]
R30  100k  Supplier 1: LCSC  Supplier Part Number 1: C122538  [R_0603]
R31  43.2k  Supplier 1: LCSC  Supplier Part Number 1: C2989349  [R_0603]
R32  1k  Supplier 1: LCSC  Supplier Part Number 1: C21190  [R_0603]
R33  100k  Supplier 1: LCSC  Supplier Part Number 1: C122538  [R_0603]
R34  43.2k  Supplier 1: LCSC  Supplier Part Number 1: C2989349  [R_0603]
R35  1k  Supplier 1: LCSC  Supplier Part Number 1: C21190  [R_0603]
R36  100k  Supplier 1: LCSC  Supplier Part Number 1: C122538  [R_0603]
R37  43.2k  Supplier 1: LCSC  Supplier Part Number 1: C2989349  [R_0603]
R38  1k  Supplier 1: LCSC  Supplier Part Number 1: C21190  [R_0603]
R39  10k  Supplier 1: LCSC  Supplier Part Number 1: C25804  [R_0603]
R40  1k  Supplier 1: LCSC  Supplier Part Number 1: C21190  [R_0603]
R41  10k  Supplier 1: LCSC  Supplier Part Number 1: C25804  [R_0603]
R42  1k  Supplier 1: LCSC  Supplier Part Number 1: C21190  [R_0603]
R43  10k  Supplier 1: LCSC  Supplier Part Number 1: C25804  [R_0603]
R44  1k  Supplier 1: LCSC  Supplier Part Number 1: C21190  [R_0603]
R45  10k  Supplier 1: LCSC  Supplier Part Number 1: C25804  [R_0603]
TP19  TP_GND  [TP_PAD_1.5mm]
U9  MCP3208-CI/SL  Supplier 1: LCSC  Supplier Part Number 1: C16939  [SOIC-16_3.9x9.9_P1.27]
U10  TLV9004IPWR  Supplier 1: LCSC  Supplier Part Number 1: C2058050  [TSSOP-14_PW_P0.65]
U11  TLV9004IPWR  Supplier 1: LCSC  Supplier Part Number 1: C2058050  [TSSOP-14_PW_P0.65]

### Ports
CS_ADC (in), MISO (bidir), MOSI (in), SCK (in)

### Nets
GND: C29.2 C30.2 C31.2 C32.2 C33.2 C34.2 C35.2 C36.2 C37.2 C38.2 C39.2 C40.2 D12.1(A1) D13.1(A1) D14.1(A1) D15.1(A1) D16.1(A1) D17.1(A1) D18.1(A1) D19.1(A1) J4.5 J5.5 R28.2 R31.2 R34.2 R37.2 TP19.1(TP) U9.9(DGND) U9.14(AGND) U10.11(V-) U11.11(V-)
V3V3_REF: C29.1 C30.1 D12.2(K2) D13.2(K2) D14.2(K2) D15.2(K2) D16.2(K2) D17.2(K2) D18.2(K2) D19.2(K2) U9.15(VREF) U9.16(VDD)
V5V0: C31.1 C32.1 U10.4(V+) U11.4(V+)
AIN0: J4.1 R27.1
AIN0_DIV: D12.3(K1A2) R27.2 R28.1 U10.3(IN1+)
AIN1: J4.2 R30.1
AIN1_DIV: D13.3(K1A2) R30.2 R31.1 U10.5(IN2+)
AIN2: J4.3 R33.1
AIN2_DIV: D14.3(K1A2) R33.2 R34.1 U10.10(IN3+)
AIN3: J4.4 R36.1
AIN3_DIV: D15.3(K1A2) R36.2 R37.1 U10.12(IN4+)
AIN4: J5.1 R39.1
AIN4_DIV: D16.3(K1A2) R39.2 U11.3(IN1+)
AIN5: J5.2 R41.1
AIN5_DIV: D17.3(K1A2) R41.2 U11.5(IN2+)
AIN6: J5.3 R43.1
AIN6_DIV: D18.3(K1A2) R43.2 U11.10(IN3+)
AIN7: J5.4 R45.1
AIN7_DIV: D19.3(K1A2) R45.2 U11.12(IN4+)
AOUT0: R26.1 U10.1(OUT1) U10.2(IN1-)
AOUT1: R29.1 U10.6(IN2-) U10.7(OUT2)
AOUT2: R32.1 U10.8(OUT3) U10.9(IN3-)
AOUT3: R35.1 U10.13(IN4-) U10.14(OUT4)
AOUT4: R38.1 U11.1(OUT1) U11.2(IN1-)
AOUT5: R40.1 U11.6(IN2-) U11.7(OUT2)
AOUT6: R42.1 U11.8(OUT3) U11.9(IN3-)
AOUT7: R44.1 U11.13(IN4-) U11.14(OUT4)
CH0: C33.1 R26.2 U9.1(CH0)
CH1: C34.1 R29.2 U9.2(CH1)
CH2: C35.1 R32.2 U9.3(CH2)
CH3: C36.1 R35.2 U9.4(CH3)
CH4: C37.1 R38.2 U9.5(CH4)
CH5: C38.1 R40.2 U9.6(CH5)
CH6: C39.1 R42.2 U9.7(CH6)
CH7: C40.1 R44.2 U9.8(CH7)
CS_ADC: U9.10(CS/SHDN) ; port CS_ADC
MISO: U9.12(DOUT) ; port MISO
MOSI: U9.11(DIN) ; port MOSI
SCK: U9.13(CLK) ; port SCK

### Notes on the sheet
- NEXUS-32 | ADC MCP3208, referencia y acondicionamiento
  UTP - Diseño Electrónico, Proyecto 2
- Diseñado por: Yesid Alejandro Yela Ruiz          Rev: 1.0
- Fecha: 2026-10-27          Hoja: 07_SPI_ADC (8/12) - NEXUS32.PrjPcb

### Library data of the parts
C29 = CAP_0603: as C23 on sheet 03_ESP32_CORE; Datasheet: https://wmsc.lcsc.com/wmsc/upload/file/pdf/v2/lcsc/2206010045_UNI-ROYAL-Uniroyal-Elec-0603WAF1002T5E_C25804.pdf; LCSC Part #: C15849
C30-C40 = CAP_0603: as C22 on sheet 03_ESP32_CORE; Datasheet: https://wmsc.lcsc.com/wmsc/upload/file/pdf/v2/lcsc/2206010045_UNI-ROYAL-Uniroyal-Elec-0603WAF1002T5E_C25804.pdf; LCSC Part #: C14663
D12-D19 = BAT54S,215: Doble diodo Schottky en serie 30V 200mA SOT-23 (Nexperia BAT54S,215); Manufacturer: Nexperia; Manufacturer Part Number: BAT54S,215; LCSC Part #: C47546; Datasheet: https://wmsc.lcsc.com/wmsc/upload/file/pdf/v2/lcsc/2410121943_Nexperia-BAT54S-215_C47546.pdf
J4 J5 = DB127S-5.08-5P-GN-S: Bornera tornillo 5 polos paso 5.08mm (Dorabo DB127S-5.08-5P-GN-S); Manufacturer: Dorabo; Manufacturer Part Number: DB127S-5.08-5P-GN-S; LCSC Part #: C2997522; Datasheet: https://wmsc.lcsc.com/wmsc/upload/file/pdf/v2/lcsc/2303211600_DORABO-DB127S-5-08-5P-GN_C2997522.pdf
R26 R29 R32 R35 R38 R40 R42 R44 = RES_0603: as R24 on sheet 03_ESP32_CORE; Datasheet: https://wmsc.lcsc.com/wmsc/upload/file/pdf/v2/lcsc/2206010045_UNI-ROYAL-Uniroyal-Elec-0603WAF1002T5E_C25804.pdf; LCSC Part #: C21190
R27 R30 R33 R36 = RES_0603: Resistencia SMD 0603; Manufacturer: YAGEO; Manufacturer Part Number: RT0603BRD07100KL; Datasheet: https://wmsc.lcsc.com/wmsc/upload/file/pdf/v2/lcsc/2206010045_UNI-ROYAL-Uniroyal-Elec-0603WAF1002T5E_C25804.pdf; LCSC Part #: C122538
R28 R31 R34 R37 = RES_0603: Resistencia SMD 0603; Manufacturer: UNI-ROYAL; Manufacturer Part Number: TC0325B4322T5F; Datasheet: https://wmsc.lcsc.com/wmsc/upload/file/pdf/v2/lcsc/2206010045_UNI-ROYAL-Uniroyal-Elec-0603WAF1002T5E_C25804.pdf; LCSC Part #: C2989349
R39 R41 R43 R45 = RES_0603: as R14 on sheet 03_ESP32_CORE; Datasheet: https://wmsc.lcsc.com/wmsc/upload/file/pdf/v2/lcsc/2206010045_UNI-ROYAL-Uniroyal-Elec-0603WAF1002T5E_C25804.pdf; LCSC Part #: C25804
TP19 = TESTPOINT: as TP10 on sheet 03_ESP32_CORE; Manufacturer: n/a; Manufacturer Part Number: TP_PAD_1.5mm; Datasheet: https://wmsc.lcsc.com/wmsc/upload/file/pdf/v2/lcsc/2206010045_UNI-ROYAL-Uniroyal-Elec-0603WAF1002T5E_C25804.pdf
U9 = MCP3208-CI/SL: ADC 12 bits 8 canales SPI SOIC-16 (Microchip MCP3208-CI/SL); Manufacturer: Microchip Technology; Manufacturer Part Number: MCP3208-CI/SL; LCSC Part #: C16939; Datasheet: https://ww1.microchip.com/downloads/en/DeviceDoc/21298e.pdf
U10 U11 = TLV9004IPWR: Amplificador operacional cuadruple RRIO 1MHz TSSOP-14 (TI TLV9004IPWR); Manufacturer: Texas Instruments; Manufacturer Part Number: TLV9004IPWR; LCSC Part #: C2058050; Datasheet: https://www.ti.com/lit/ds/symlink/tlv9004.pdf

## Sheet 08_SPI_ETHERNET.SchDoc
size A3
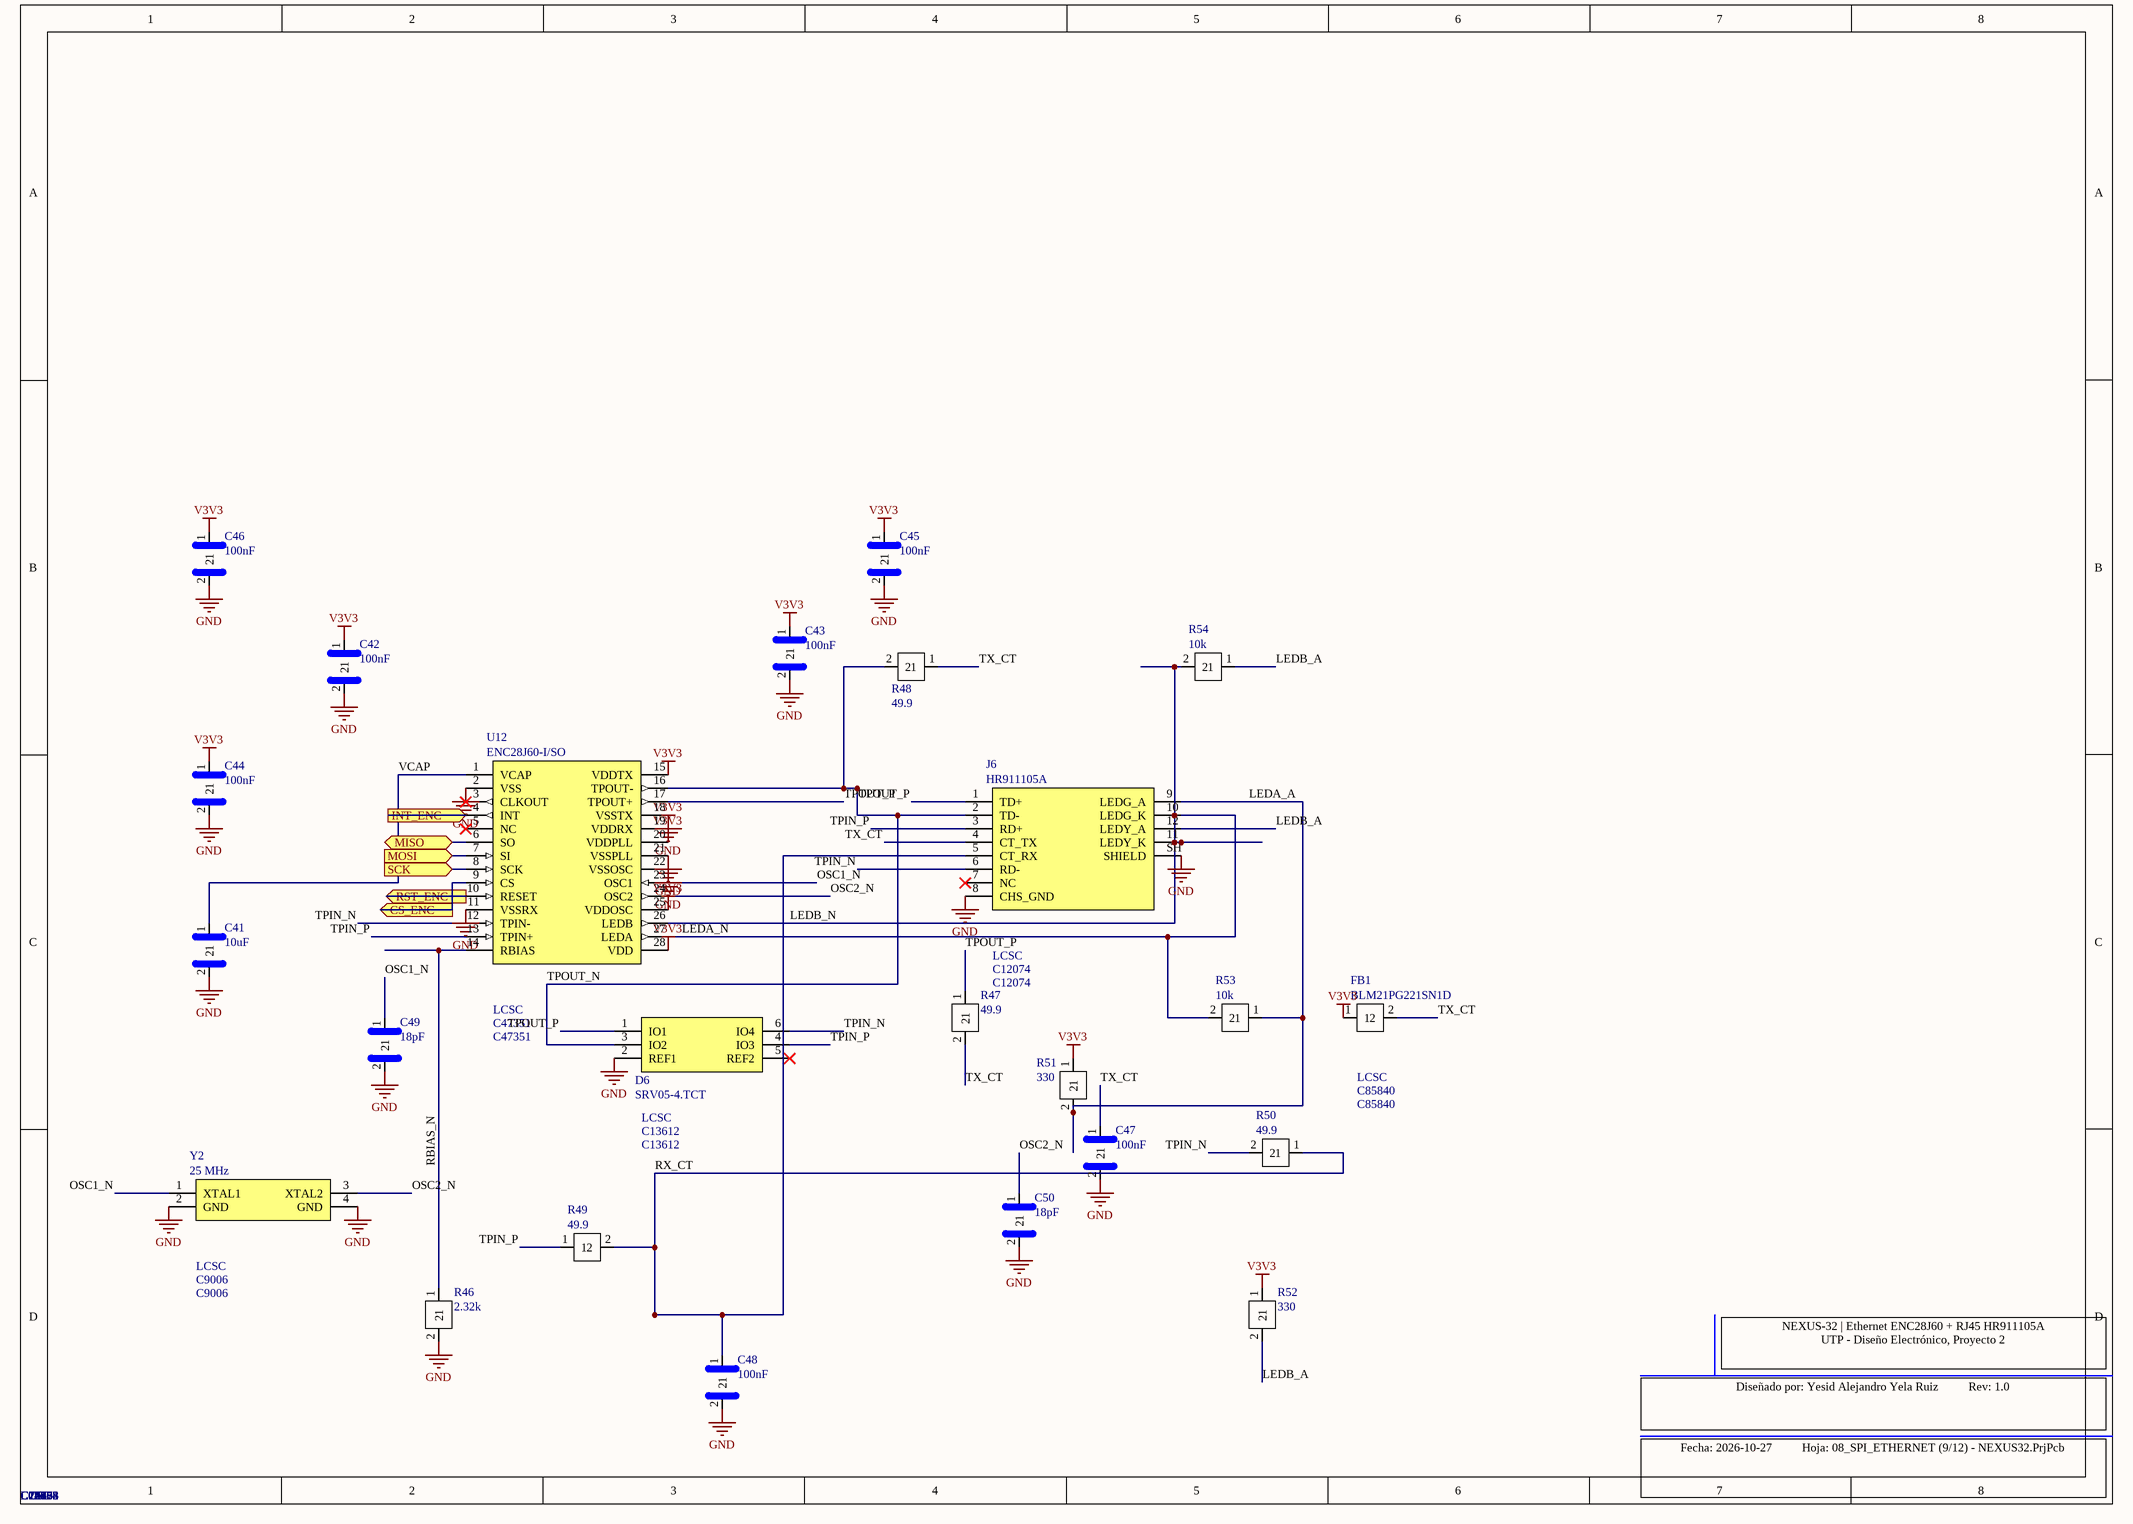
[diagram p7: 08_SPI_ETHERNET.SchDoc]

### Parts
C41  10uF  Supplier 1: LCSC  Supplier Part Number 1: C19702  [R_0603]
C42  100nF  Supplier 1: LCSC  Supplier Part Number 1: C14663  [R_0603]
C43  100nF  Supplier 1: LCSC  Supplier Part Number 1: C14663  [R_0603]
C44  100nF  Supplier 1: LCSC  Supplier Part Number 1: C14663  [R_0603]
C45  100nF  Supplier 1: LCSC  Supplier Part Number 1: C14663  [R_0603]
C46  100nF  Supplier 1: LCSC  Supplier Part Number 1: C14663  [R_0603]
C47  100nF  Supplier 1: LCSC  Supplier Part Number 1: C14663  [R_0603]
C48  100nF  Supplier 1: LCSC  Supplier Part Number 1: C14663  [R_0603]
C49  18pF  Supplier 1: LCSC  Supplier Part Number 1: C1647  [R_0603]
C50  18pF  Supplier 1: LCSC  Supplier Part Number 1: C1647  [R_0603]
D6  SRV05-4.TCT  Supplier 1: LCSC  Supplier Part Number 1: C13612  [SOT-23-6_SRV05-4]
FB1  BLM21PG221SN1D  Supplier 1: LCSC  Supplier Part Number 1: C85840  [FB_0805]
J6  HR911105A  Supplier 1: LCSC  Supplier Part Number 1: C12074  [RJ45_HR911105A]
R46  2.32k  Supplier 1: LCSC  Supplier Part Number 1: C22905  [R_0603]
R47  49.9  Supplier 1: LCSC  Supplier Part Number 1: C23185  [R_0603]
R48  49.9  Supplier 1: LCSC  Supplier Part Number 1: C23185  [R_0603]
R49  49.9  Supplier 1: LCSC  Supplier Part Number 1: C23185  [R_0603]
R50  49.9  Supplier 1: LCSC  Supplier Part Number 1: C23185  [R_0603]
R51  330  Supplier 1: LCSC  Supplier Part Number 1: C23138  [R_0603]
R52  330  Supplier 1: LCSC  Supplier Part Number 1: C23138  [R_0603]
R53  10k  Supplier 1: LCSC  Supplier Part Number 1: C25804  [R_0603]
R54  10k  Supplier 1: LCSC  Supplier Part Number 1: C25804  [R_0603]
U12  ENC28J60-I/SO  Supplier 1: LCSC  Supplier Part Number 1: C47351  [SOIC-28W_7.5x17.9_P1.27]
Y2  25 MHz  Supplier 1: LCSC  Supplier Part Number 1: C9006  [XTAL_3225_4P]

### Ports
CS_ENC (in), INT_ENC (out), MISO (bidir), MOSI (in), RST_ENC (in), SCK (in)

### Nets
GND: C41.2 C42.2 C43.2 C44.2 C45.2 C46.2 C47.2 C48.2 C49.2 C50.2 D6.2(REF1) J6.8(CHS_GND) J6.SH(SHIELD) R46.2 U12.2(VSS) U12.11(VSSRX) U12.18(VSSTX) U12.21(VSSPLL) U12.22(VSSOSC) Y2.2(GND) Y2.4(GND)
V3V3: C42.1 C43.1 C44.1 C45.1 C46.1 FB1.1 R51.1 R52.1 U12.15(VDDTX) U12.19(VDDRX) U12.20(VDDPLL) U12.25(VDDOSC) U12.28(VDD)
CS_ENC: U12.9(CS) ; port CS_ENC
INT_ENC: U12.4(INT) ; port INT_ENC
LEDA_A: J6.9(LEDG_A) R51.2 R53.1
LEDA_N: J6.10(LEDG_K) R53.2 U12.27(LEDA)
LEDB_A: J6.12(LEDY_A) R52.2 R54.1
LEDB_N: J6.11(LEDY_K) R54.2 U12.26(LEDB)
MISO: U12.6(SO) ; port MISO
MOSI: U12.7(SI) ; port MOSI
OSC1_N: C49.1 U12.23(OSC1) Y2.1(XTAL1)
OSC2_N: C50.1 U12.24(OSC2) Y2.3(XTAL2)
RBIAS_N: R46.1 U12.14(RBIAS)
RST_ENC: U12.10(RESET) ; port RST_ENC
RX_CT: C48.1 J6.5(CT_RX) R49.2 R50.1
SCK: U12.8(SCK) ; port SCK
TPIN_N: D6.6(IO4) J6.6(RD-) R50.2 U12.12(TPIN-)
TPIN_P: D6.4(IO3) J6.3(RD+) R49.1 U12.13(TPIN+)
TPOUT_N: D6.3(IO2) J6.2(TD-) R48.2 U12.16(TPOUT-)
TPOUT_P: D6.1(IO1) J6.1(TD+) R47.1 U12.17(TPOUT+)
TX_CT: C47.1 FB1.2 J6.4(CT_TX) R47.2 R48.1
VCAP: C41.1 U12.1(VCAP)

Not connected (* = marked no-connect by the designer): D6 5(REF2)*; J6 7(NC)*; U12 3(CLKOUT)* 5(NC)*

### Notes on the sheet
- NEXUS-32 | Ethernet ENC28J60 + RJ45 HR911105A
  UTP - Diseño Electrónico, Proyecto 2
- Diseñado por: Yesid Alejandro Yela Ruiz          Rev: 1.0
- Fecha: 2026-10-27          Hoja: 08_SPI_ETHERNET (9/12) - NEXUS32.PrjPcb

### Library data of the parts
C41 = CAP_0603: as C21 on sheet 03_ESP32_CORE; Datasheet: https://wmsc.lcsc.com/wmsc/upload/file/pdf/v2/lcsc/2206010045_UNI-ROYAL-Uniroyal-Elec-0603WAF1002T5E_C25804.pdf; LCSC Part #: C19702
C42-C48 = CAP_0603: as C22 on sheet 03_ESP32_CORE; Datasheet: https://wmsc.lcsc.com/wmsc/upload/file/pdf/v2/lcsc/2206010045_UNI-ROYAL-Uniroyal-Elec-0603WAF1002T5E_C25804.pdf; LCSC Part #: C14663
C49 C50 = CAP_0603: Condensador ceramico SMD 0603; Manufacturer: Samsung; Manufacturer Part Number: CL10C180JB8NNNC; Datasheet: https://wmsc.lcsc.com/wmsc/upload/file/pdf/v2/lcsc/2206010045_UNI-ROYAL-Uniroyal-Elec-0603WAF1002T5E_C25804.pdf; LCSC Part #: C1647
D6 = SRV05-4.TCT: Matriz TVS 4 lineas 5V SOT-23-6 (Semtech SRV05-4.TCT); Manufacturer: Semtech; Manufacturer Part Number: SRV05-4.TCT; LCSC Part #: C13612; Datasheet: https://wmsc.lcsc.com/wmsc/upload/file/pdf/v2/lcsc/1809212114_SEMTECH-SRV05-4-TCT_C13612.pdf
FB1 = FERRITE_0805: Ferrita 220R@100MHz 0805 (Murata BLM21PG221SN1D); Manufacturer: Murata; Manufacturer Part Number: BLM21PG221SN1D; LCSC Part #: C85840; Datasheet: https://wmsc.lcsc.com/wmsc/upload/file/pdf/v2/lcsc/2304140030_Murata-Electronics-BLM21PG221SN1D_C85840.pdf
J6 = HR911105A: RJ45 con magneticos 1CT:1CT y 2 LED, 10/100 (HanRun HR911105A); P8 = CHS GND; LED verde 9(A)-10(K), amarillo 12(A)-11(K); Manufacturer: HanRun; Manufacturer Part Number: HR911105A; LCSC Part #: C12074; Datasheet: https://wmsc.lcsc.com/wmsc/upload/file/pdf/v2/lcsc/2409302333_HANRUN-Zhongshan-HanRun-Elec-HR911105A_C12074.pdf
R46 = RES_0603: Resistencia SMD 0603; Manufacturer: UNI-ROYAL; Manufacturer Part Number: 0603WAF2321T5E; Datasheet: https://wmsc.lcsc.com/wmsc/upload/file/pdf/v2/lcsc/2206010045_UNI-ROYAL-Uniroyal-Elec-0603WAF1002T5E_C25804.pdf; LCSC Part #: C22905
R47-R50 = RES_0603: Resistencia SMD 0603; Manufacturer: UNI-ROYAL; Manufacturer Part Number: 0603WAF499JT5E; Datasheet: https://wmsc.lcsc.com/wmsc/upload/file/pdf/v2/lcsc/2206010045_UNI-ROYAL-Uniroyal-Elec-0603WAF1002T5E_C25804.pdf; LCSC Part #: C23185
R51 R52 = RES_0603: Resistencia SMD 0603; Manufacturer: UNI-ROYAL; Manufacturer Part Number: 0603WAF3300T5E; Datasheet: https://wmsc.lcsc.com/wmsc/upload/file/pdf/v2/lcsc/2206010045_UNI-ROYAL-Uniroyal-Elec-0603WAF1002T5E_C25804.pdf; LCSC Part #: C23138
R53 R54 = RES_0603: as R14 on sheet 03_ESP32_CORE; Datasheet: https://wmsc.lcsc.com/wmsc/upload/file/pdf/v2/lcsc/2206010045_UNI-ROYAL-Uniroyal-Elec-0603WAF1002T5E_C25804.pdf; LCSC Part #: C25804
U12 = ENC28J60-I/SO: Controlador Ethernet 10BASE-T SPI SOIC-28 (Microchip ENC28J60-I/SO); Manufacturer: Microchip Technology; Manufacturer Part Number: ENC28J60-I/SO; LCSC Part #: C47351; Datasheet: https://ww1.microchip.com/downloads/en/DeviceDoc/39662e.pdf
Y2 = XTAL_3225: Cristal 25MHz 12pF SMD 3225 4 pads (YXC X322525MOB4SI); terminales 1 y 3, carcasa 2 y 4 a GND; Manufacturer: YXC (Yangxing Technology); Manufacturer Part Number: X322525MOB4SI; LCSC Part #: C9006; Datasheet: https://wmsc.lcsc.com/wmsc/upload/file/pdf/v2/lcsc/2403291504_YXC-Crystal-Oscillators-X322525MOB4SI_C9006.pdf

## Sheet 09_SPI_LORA.SchDoc
size A4
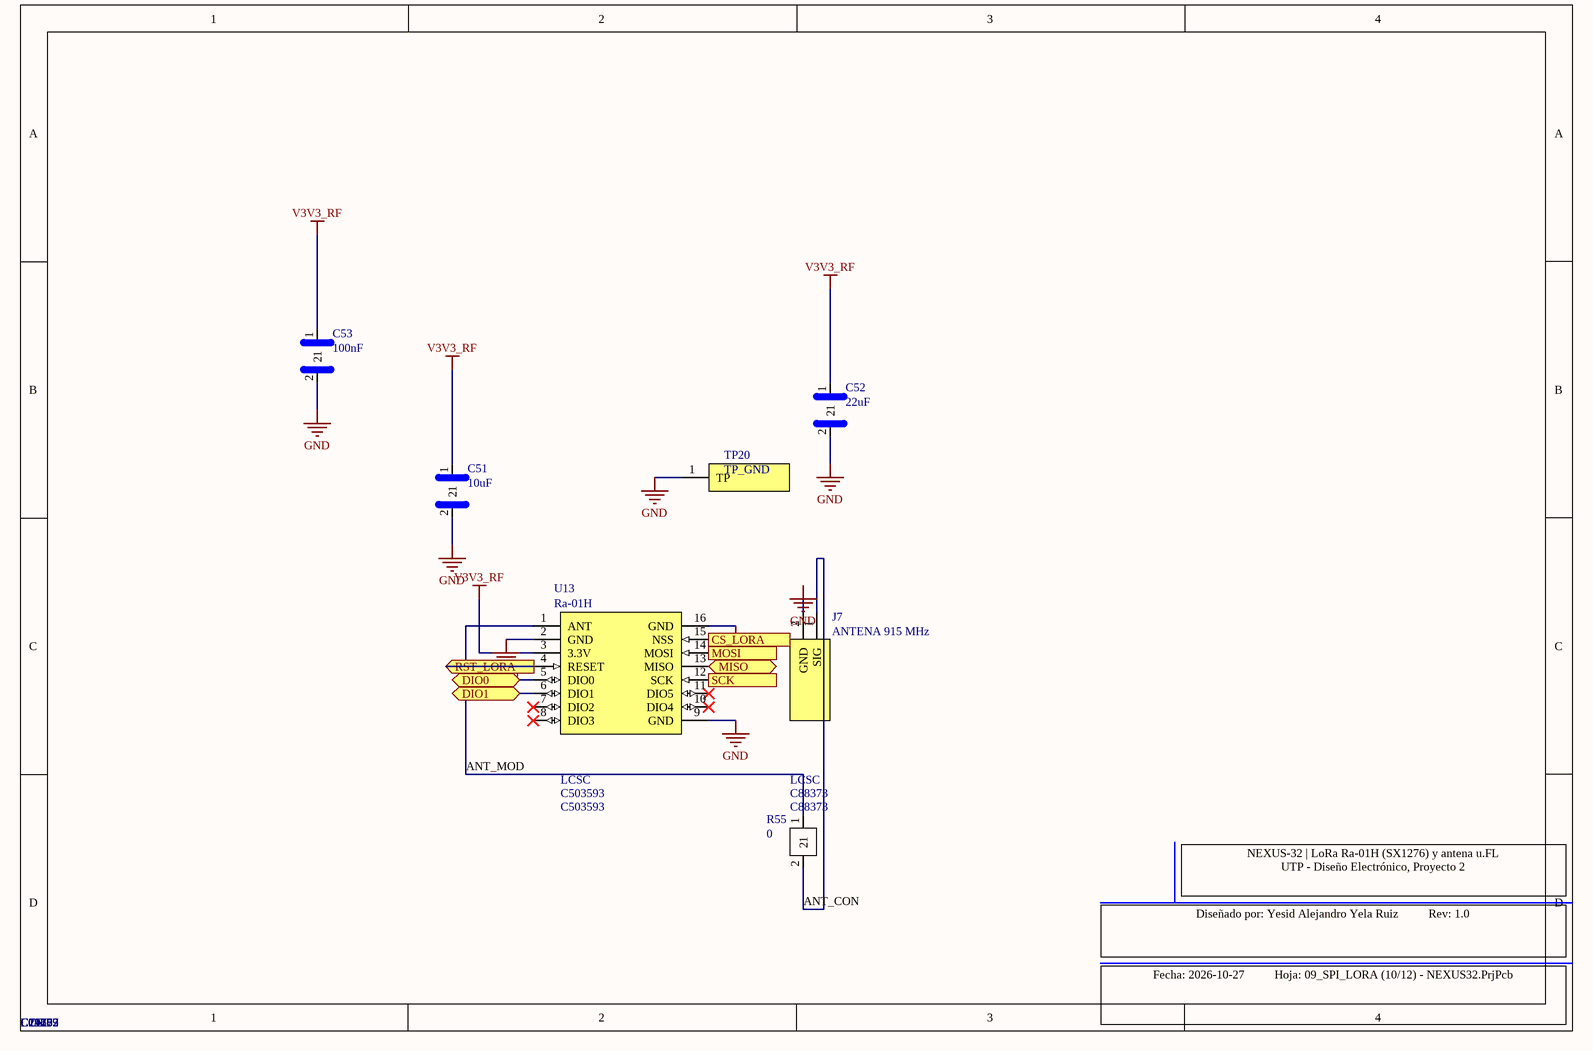
[diagram p8: 09_SPI_LORA.SchDoc]

### Parts
C51  10uF  Supplier 1: LCSC  Supplier Part Number 1: C19702  [R_0603]
C52  22uF  Supplier 1: LCSC  Supplier Part Number 1: C29277  [C_0805]
C53  100nF  Supplier 1: LCSC  Supplier Part Number 1: C14663  [R_0603]
J7  ANTENA 915 MHz  Supplier 1: LCSC  Supplier Part Number 1: C88373  [UFL_R_SMT_1]
R55  0  Supplier 1: LCSC  Supplier Part Number 1: C21189  [R_0603]
TP20  TP_GND  [TP_PAD_1.5mm]
U13  Ra-01H  Supplier 1: LCSC  Supplier Part Number 1: C503593  [MODULE_Ra-01H]

### Ports
CS_LORA (in), DIO0 (bidir), DIO1 (bidir), MISO (bidir), MOSI (in), RST_LORA (in), SCK (in)

### Nets
GND: C51.2 C52.2 C53.2 J7.2(GND) TP20.1(TP) U13.2(GND) U13.9(GND) U13.16(GND)
V3V3_RF: C51.1 C52.1 C53.1 U13.3(3.3V)
ANT_CON: J7.1(SIG) R55.2
ANT_MOD: R55.1 U13.1(ANT)
CS_LORA: U13.15(NSS) ; port CS_LORA
DIO0: U13.5(DIO0) ; port DIO0
DIO1: U13.6(DIO1) ; port DIO1
MISO: U13.13(MISO) ; port MISO
MOSI: U13.14(MOSI) ; port MOSI
RST_LORA: U13.4(RESET) ; port RST_LORA
SCK: U13.12(SCK) ; port SCK

Not connected (* = marked no-connect by the designer): U13 7(DIO2)* 8(DIO3)* 10(DIO4)* 11(DIO5)*

### Notes on the sheet
- NEXUS-32 | LoRa Ra-01H (SX1276) y antena u.FL
  UTP - Diseño Electrónico, Proyecto 2
- Diseñado por: Yesid Alejandro Yela Ruiz          Rev: 1.0
- Fecha: 2026-10-27          Hoja: 09_SPI_LORA (10/12) - NEXUS32.PrjPcb

### Library data of the parts
C51 = CAP_0603: as C21 on sheet 03_ESP32_CORE; Datasheet: https://wmsc.lcsc.com/wmsc/upload/file/pdf/v2/lcsc/2206010045_UNI-ROYAL-Uniroyal-Elec-0603WAF1002T5E_C25804.pdf; LCSC Part #: C19702
C52 = CAP_0805: as C20 on sheet 03_ESP32_CORE; Datasheet: https://wmsc.lcsc.com/wmsc/upload/file/pdf/v2/lcsc/2206010045_UNI-ROYAL-Uniroyal-Elec-0603WAF1002T5E_C25804.pdf; LCSC Part #: C29277
C53 = CAP_0603: as C22 on sheet 03_ESP32_CORE; Datasheet: https://wmsc.lcsc.com/wmsc/upload/file/pdf/v2/lcsc/2206010045_UNI-ROYAL-Uniroyal-Elec-0603WAF1002T5E_C25804.pdf; LCSC Part #: C14663
J7 = UFL-R-SMT-1: Conector coaxial U.FL receptaculo SMD (Hirose U.FL-R-SMT-1(10)); 1 = senal, 2 = GND (2 pads); Manufacturer: Hirose Electric (HRS); Manufacturer Part Number: U.FL-R-SMT-1(10); LCSC Part #: C88373; Datasheet: https://wmsc.lcsc.com/wmsc/upload/file/pdf/v2/lcsc/2206010045_UNI-ROYAL-Uniroyal-Elec-0603WAF1002T5E_C25804.pdf
R55 = RES_0603: Resistencia SMD 0603; Manufacturer: UNI-ROYAL; Manufacturer Part Number: 0603WAF0000T5E; Datasheet: https://wmsc.lcsc.com/wmsc/upload/file/pdf/v2/lcsc/2206010045_UNI-ROYAL-Uniroyal-Elec-0603WAF1002T5E_C25804.pdf; LCSC Part #: C21189
TP20 = TESTPOINT: as TP10 on sheet 03_ESP32_CORE; Manufacturer: n/a; Manufacturer Part Number: TP_PAD_1.5mm; Datasheet: https://wmsc.lcsc.com/wmsc/upload/file/pdf/v2/lcsc/2206010045_UNI-ROYAL-Uniroyal-Elec-0603WAF1002T5E_C25804.pdf
U13 = Ra-01H: Modulo LoRa SX1276 803-930MHz SMD-16 (Ai-Thinker Ra-01H); Manufacturer: Ai-Thinker; Manufacturer Part Number: Ra-01H; LCSC Part #: C503593; Datasheet: https://wmsc.lcsc.com/wmsc/upload/file/pdf/v2/lcsc/2004022132_Ai-Thinker-Ra-01H_C503593.pdf

## Sheet 11_DIGITAL_OUTPUTS.SchDoc
size A3
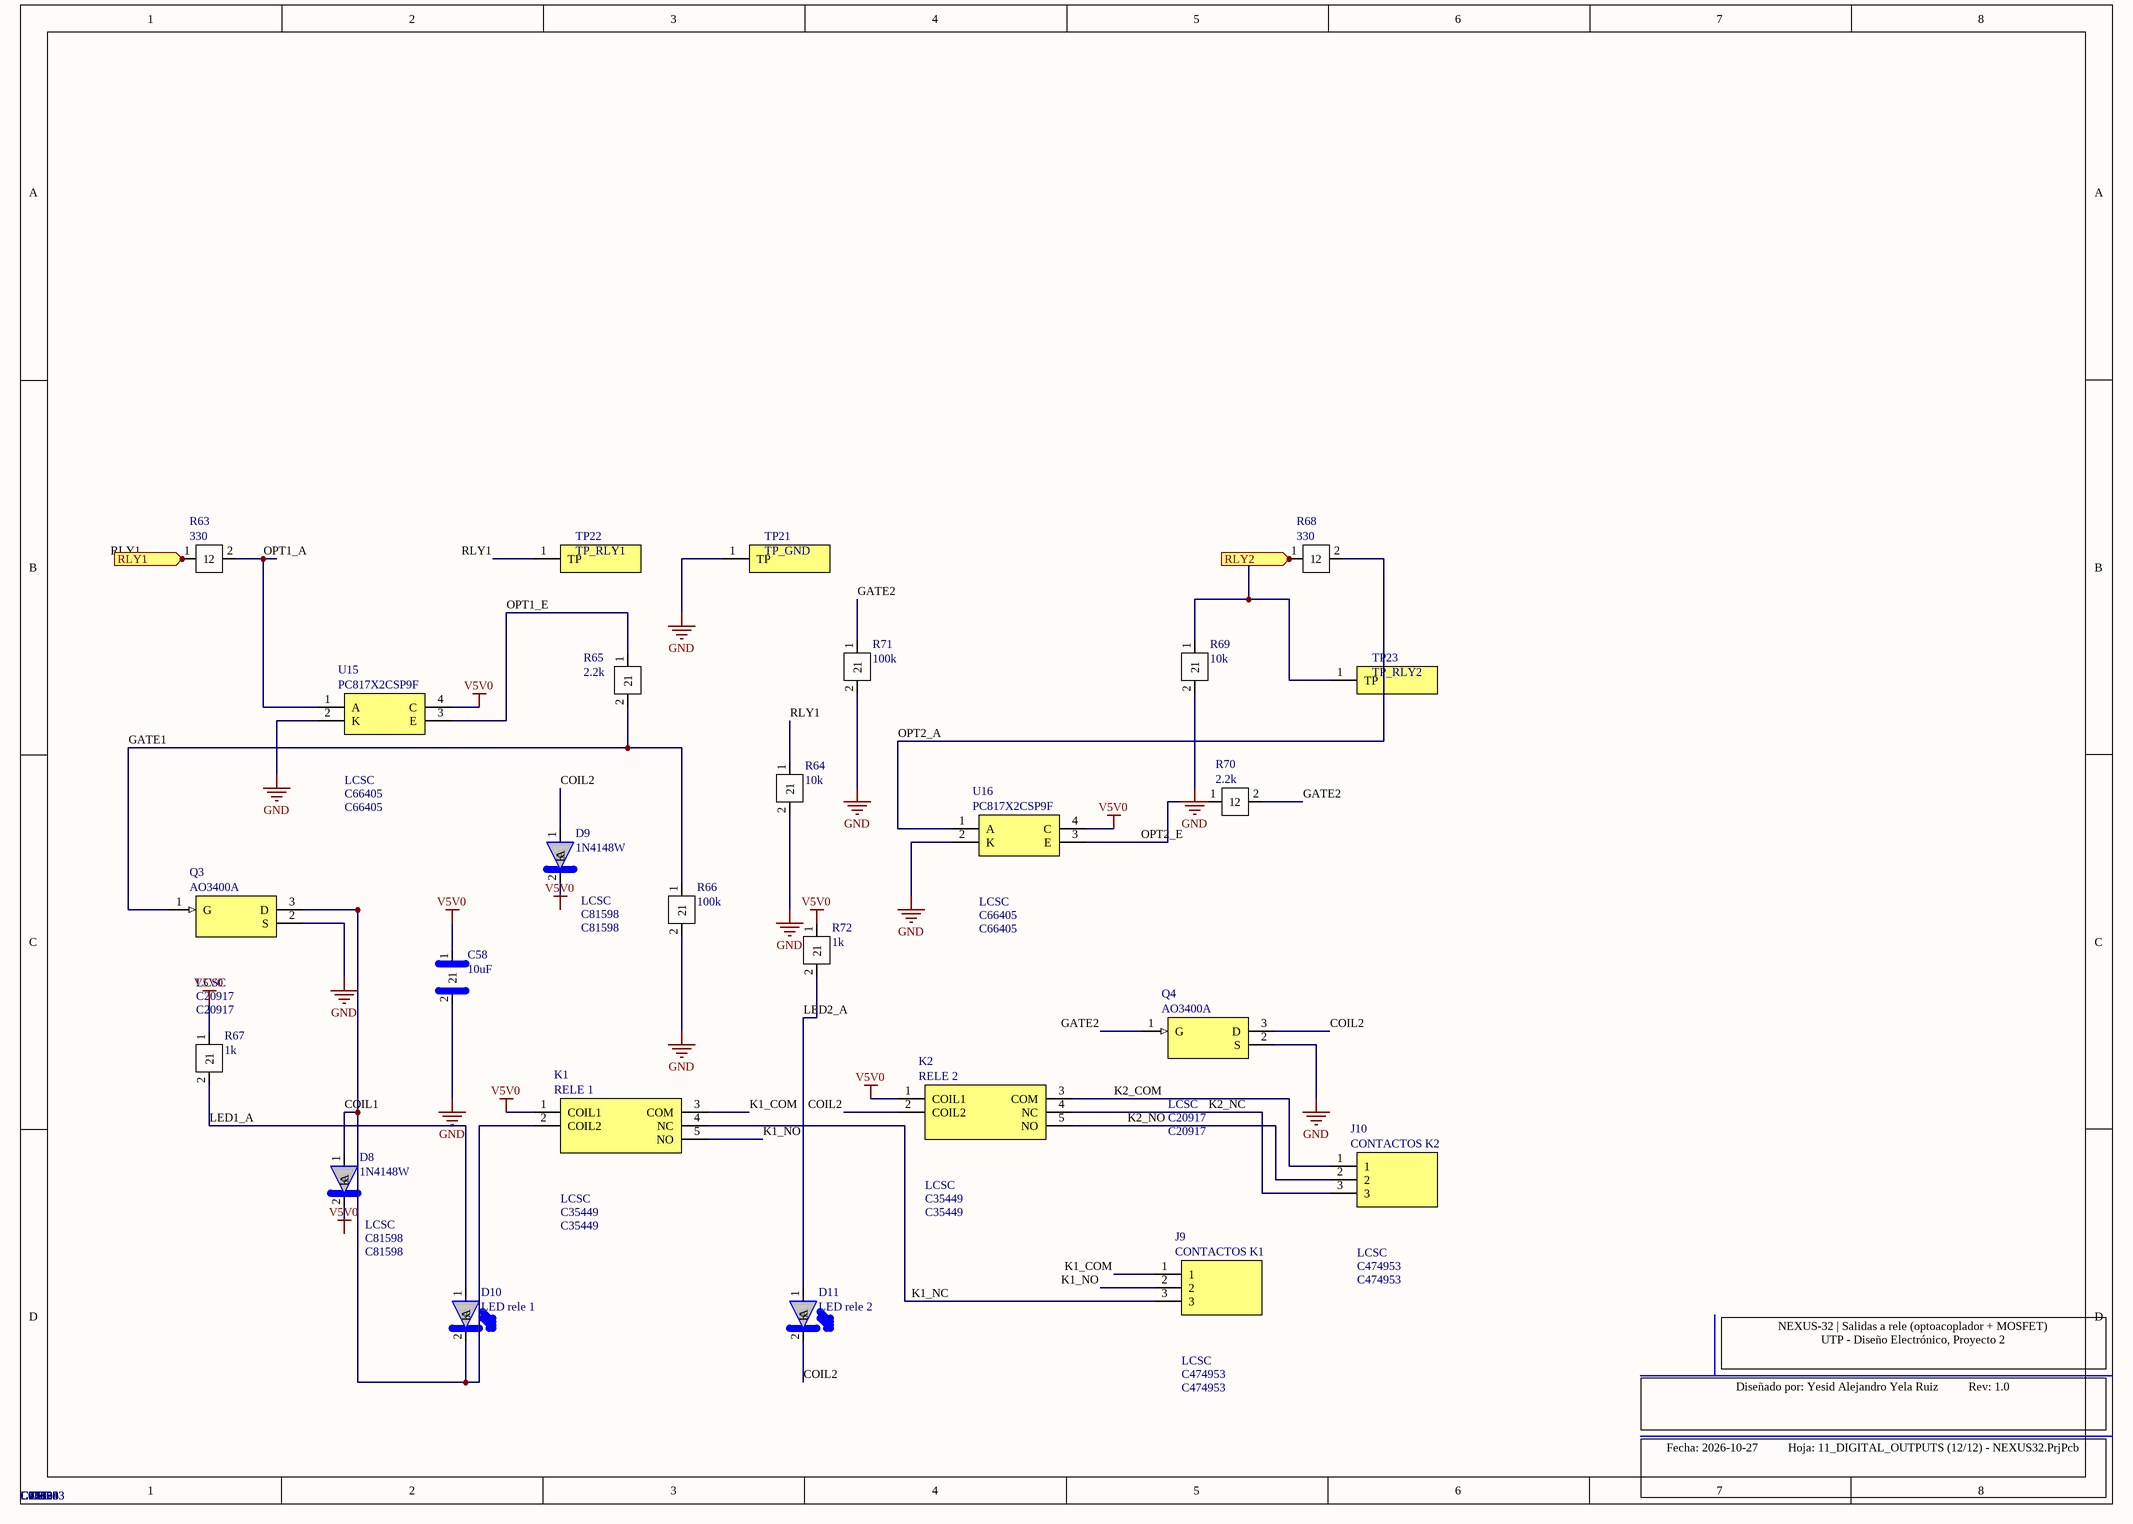
[diagram p9: 11_DIGITAL_OUTPUTS.SchDoc]

### Parts
C58  10uF  Supplier 1: LCSC  Supplier Part Number 1: C1713  [C_0805]
D8  1N4148W  Supplier 1: LCSC  Supplier Part Number 1: C81598  [D_SOD-123]
D9  1N4148W  Supplier 1: LCSC  Supplier Part Number 1: C81598  [D_SOD-123]
D10  LED rele 1  Supplier 1: LCSC  Supplier Part Number 1: C12624  [LED_0603]
D11  LED rele 2  Supplier 1: LCSC  Supplier Part Number 1: C965803  [LED_0603]
J9  CONTACTOS K1  Supplier 1: LCSC  Supplier Part Number 1: C474953  [TB_KF128-5.08-3P]
J10  CONTACTOS K2  Supplier 1: LCSC  Supplier Part Number 1: C474953  [TB_KF128-5.08-3P]
K1  RELE 1  Supplier 1: LCSC  Supplier Part Number 1: C35449  [RELAY_SRD-05VDC-SL-C]
K2  RELE 2  Supplier 1: LCSC  Supplier Part Number 1: C35449  [RELAY_SRD-05VDC-SL-C]
Q3  AO3400A  Supplier 1: LCSC  Supplier Part Number 1: C20917  [SOT-23-3_DBZ]
Q4  AO3400A  Supplier 1: LCSC  Supplier Part Number 1: C20917  [SOT-23-3_DBZ]
R63  330  Supplier 1: LCSC  Supplier Part Number 1: C23138  [R_0603]
R64  10k  Supplier 1: LCSC  Supplier Part Number 1: C25804  [R_0603]
R65  2.2k  Supplier 1: LCSC  Supplier Part Number 1: C4190  [R_0603]
R66  100k  Supplier 1: LCSC  Supplier Part Number 1: C25803  [R_0603]
R67  1k  Supplier 1: LCSC  Supplier Part Number 1: C21190  [R_0603]
R68  330  Supplier 1: LCSC  Supplier Part Number 1: C23138  [R_0603]
R69  10k  Supplier 1: LCSC  Supplier Part Number 1: C25804  [R_0603]
R70  2.2k  Supplier 1: LCSC  Supplier Part Number 1: C4190  [R_0603]
R71  100k  Supplier 1: LCSC  Supplier Part Number 1: C25803  [R_0603]
R72  1k  Supplier 1: LCSC  Supplier Part Number 1: C21190  [R_0603]
TP21  TP_GND  [TP_PAD_1.5mm]
TP22  TP_RLY1  [TP_PAD_1.5mm]
TP23  TP_RLY2  [TP_PAD_1.5mm]
U15  PC817X2CSP9F  Supplier 1: LCSC  Supplier Part Number 1: C66405  [SOP-4_PC817X_L10.16]
U16  PC817X2CSP9F  Supplier 1: LCSC  Supplier Part Number 1: C66405  [SOP-4_PC817X_L10.16]

### Ports
RLY1 (in), RLY2 (in)

### Nets
GND: C58.2 Q3.2(S) Q4.2(S) R64.2 R66.2 R69.2 R71.2 TP21.1(TP) U15.2(K) U16.2(K)
V5V0: C58.1 D8.2(K) D9.2(K) K1.1(COIL1) K2.1(COIL1) R67.1 R72.1 U15.4(C) U16.4(C)
COIL1: D8.1(A) D10.2(K) K1.2(COIL2) Q3.3(D)
COIL2: D9.1(A) D11.2(K) K2.2(COIL2) Q4.3(D)
GATE1: Q3.1(G) R65.2 R66.1
GATE2: Q4.1(G) R70.2 R71.1
K1_COM: J9.1 K1.3(COM)
K1_NC: J9.3 K1.4(NC)
K1_NO: J9.2 K1.5(NO)
K2_COM: J10.1 K2.3(COM)
K2_NC: J10.3 K2.4(NC)
K2_NO: J10.2 K2.5(NO)
LED1_A: D10.1(A) R67.2
LED2_A: D11.1(A) R72.2
OPT1_A: R63.2 U15.1(A)
OPT1_E: R65.1 U15.3(E)
OPT2_A: R68.2 U16.1(A)
OPT2_E: R70.1 U16.3(E)
RLY1: R63.1 R64.1 TP22.1(TP) ; port RLY1
RLY2: R68.1 R69.1 TP23.1(TP) ; port RLY2

### Notes on the sheet
- NEXUS-32 | Salidas a rele (optoacoplador + MOSFET)
  UTP - Diseño Electrónico, Proyecto 2
- Diseñado por: Yesid Alejandro Yela Ruiz          Rev: 1.0
- Fecha: 2026-10-27          Hoja: 11_DIGITAL_OUTPUTS (12/12) - NEXUS32.PrjPcb

### Library data of the parts
C58 = CAP_0805: Condensador ceramico SMD 0603; Manufacturer: Samsung; Manufacturer Part Number: CL21A106KOQNNNE; Datasheet: https://wmsc.lcsc.com/wmsc/upload/file/pdf/v2/lcsc/2206010045_UNI-ROYAL-Uniroyal-Elec-0603WAF1002T5E_C25804.pdf; LCSC Part #: C1713
D8 D9 = 1N4148W: Diodo de conmutacion 75V 150mA SOD-123 (Semtech 1N4148W); Manufacturer: Semtech; Manufacturer Part Number: 1N4148W; LCSC Part #: C81598; Datasheet: https://wmsc.lcsc.com/wmsc/upload/file/pdf/v2/lcsc/1811061725_ST-Semtech-1N4148W_C81598.pdf
D10 = LED_0603: LED SMD 0603; Manufacturer: Hubei KENTO; Manufacturer Part Number: KT-0603G; Datasheet: https://wmsc.lcsc.com/wmsc/upload/file/pdf/v2/lcsc/2206010045_UNI-ROYAL-Uniroyal-Elec-0603WAF1002T5E_C25804.pdf; LCSC Part #: C12624
D11 = LED_0603: LED SMD 0603; Manufacturer: XINGLIGHT; Manufacturer Part Number: XL-1608UYC-04; Datasheet: https://wmsc.lcsc.com/wmsc/upload/file/pdf/v2/lcsc/2206010045_UNI-ROYAL-Uniroyal-Elec-0603WAF1002T5E_C25804.pdf; LCSC Part #: C965803
J9 J10 = KF128-5.08-3P-AA: Bornera tornillo 3 polos paso 5.08mm (Cixi Kefa KF128-5.08-3P-AA); Manufacturer: Cixi Kefa Electronics (KEFA); Manufacturer Part Number: KF128-5.08-3P-AA; LCSC Part #: C474953; Datasheet: https://wmsc.lcsc.com/wmsc/upload/file/pdf/v2/lcsc/2408211511_Cixi-Kefa-Elec-KF128-5-08-3P-AA_C474953.pdf
K1 K2 = SRD-05VDC-SL-C: Rele SPDT 5V bobina 70 ohm (Songle SRD-05VDC-SL-C); 1-2 bobina, 3 COM, 4 NC, 5 NO; Manufacturer: Songle Relay; Manufacturer Part Number: SRD-05VDC-SL-C; LCSC Part #: C35449; Datasheet: https://wmsc.lcsc.com/wmsc/upload/file/pdf/v2/lcsc/2304140030_Ningbo-Songle-Relay-SRD-05VDC-SL-C_C35449.pdf
Q3 Q4 = AO3400A: MOSFET canal N 30V 5.7A SOT-23 (Alpha and Omega AO3400A); Manufacturer: Alpha & Omega Semiconductor; Manufacturer Part Number: AO3400A; LCSC Part #: C20917; Datasheet: https://wmsc.lcsc.com/wmsc/upload/file/pdf/v2/lcsc/1811081213_Alpha---Omega-Semicon-AO3400A_C20917.pdf
R63 R68 = RES_0603: as R51 on sheet 08_SPI_ETHERNET; Datasheet: https://wmsc.lcsc.com/wmsc/upload/file/pdf/v2/lcsc/2206010045_UNI-ROYAL-Uniroyal-Elec-0603WAF1002T5E_C25804.pdf; LCSC Part #: C23138
R64 R69 = RES_0603: as R14 on sheet 03_ESP32_CORE; Datasheet: https://wmsc.lcsc.com/wmsc/upload/file/pdf/v2/lcsc/2206010045_UNI-ROYAL-Uniroyal-Elec-0603WAF1002T5E_C25804.pdf; LCSC Part #: C25804
R65 R70 = RES_0603: Resistencia SMD 0603; Manufacturer: UNI-ROYAL; Manufacturer Part Number: 0603WAF2201T5E; Datasheet: https://wmsc.lcsc.com/wmsc/upload/file/pdf/v2/lcsc/2206010045_UNI-ROYAL-Uniroyal-Elec-0603WAF1002T5E_C25804.pdf; LCSC Part #: C4190
R66 R71 = RES_0603: Resistencia SMD 0603; Manufacturer: UNI-ROYAL; Manufacturer Part Number: 0603WAF1003T5E; Datasheet: https://wmsc.lcsc.com/wmsc/upload/file/pdf/v2/lcsc/2206010045_UNI-ROYAL-Uniroyal-Elec-0603WAF1002T5E_C25804.pdf; LCSC Part #: C25803
R67 R72 = RES_0603: as R24 on sheet 03_ESP32_CORE; Datasheet: https://wmsc.lcsc.com/wmsc/upload/file/pdf/v2/lcsc/2206010045_UNI-ROYAL-Uniroyal-Elec-0603WAF1002T5E_C25804.pdf; LCSC Part #: C21190
TP21-TP23 = TESTPOINT: as TP10 on sheet 03_ESP32_CORE; Manufacturer: n/a; Manufacturer Part Number: TP_PAD_1.5mm; Datasheet: https://wmsc.lcsc.com/wmsc/upload/file/pdf/v2/lcsc/2206010045_UNI-ROYAL-Uniroyal-Elec-0603WAF1002T5E_C25804.pdf
U15 U16 = PC817X2CSP9F: Optoacoplador fototransistor 5kV SMD-4 (Sharp PC817X2CSP9F); Manufacturer: Sharp; Manufacturer Part Number: PC817X2CSP9F; LCSC Part #: C66405; Datasheet: https://wmsc.lcsc.com/wmsc/upload/file/pdf/v2/lcsc/2304140030_Sharp-Microelectronics-PC817X2CSP9F_C66405.pdf